# EAGLE schematic FRIDAY_Compute_SCH1 (EAGLE 9.6.2), part 2 of 2
## Sheet 5 of 5: S5: RK3576 Clock, Reset, Boot, PMIC Control & Debug UART
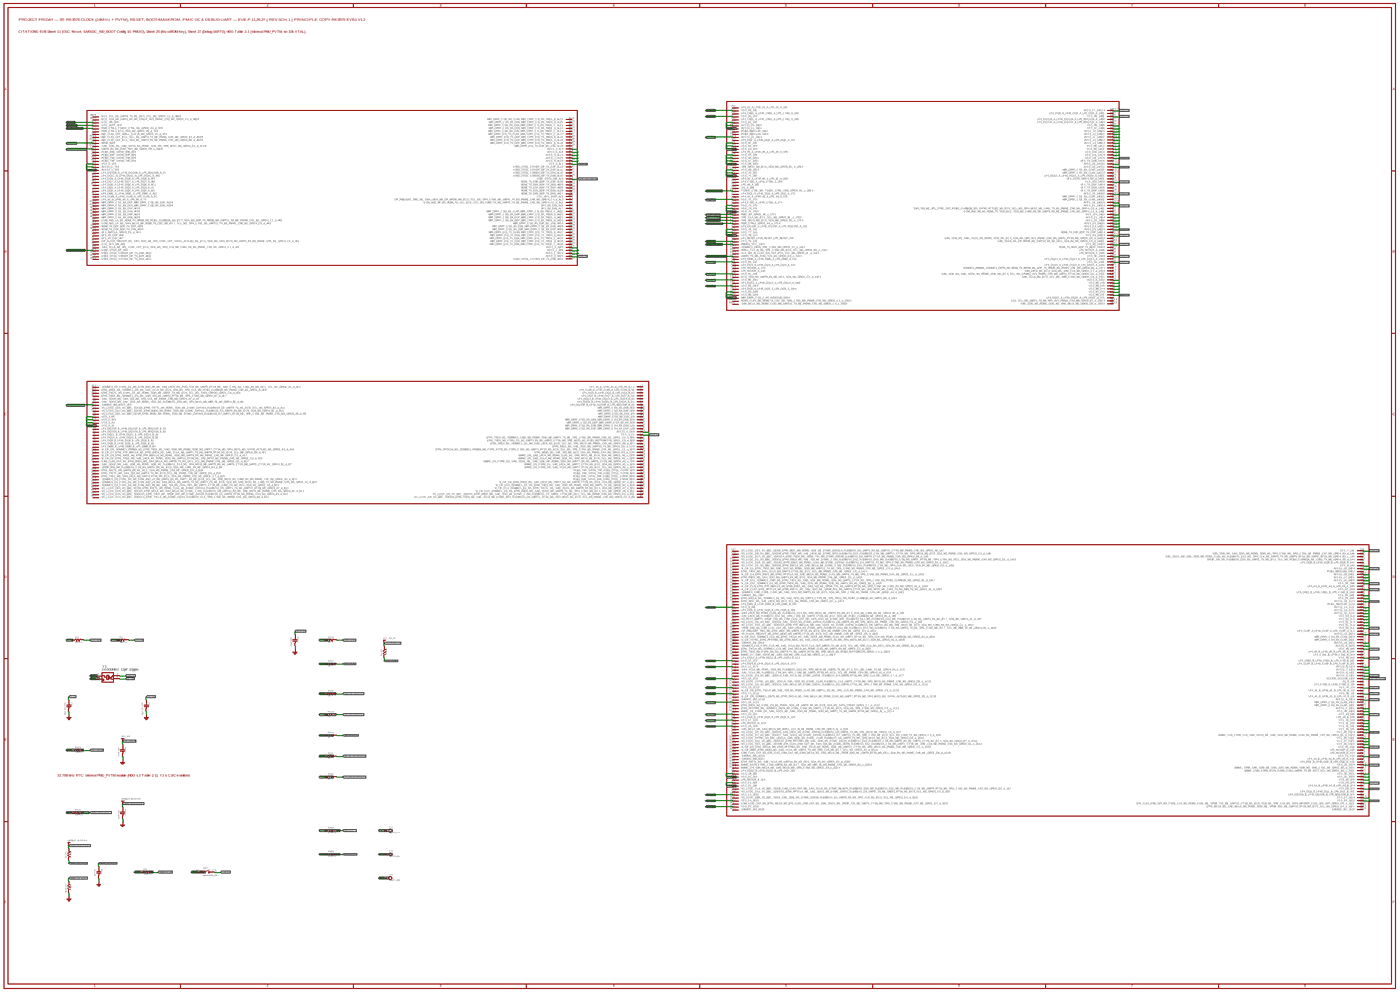
[diagram p13: schematic, sheet 5, overview]
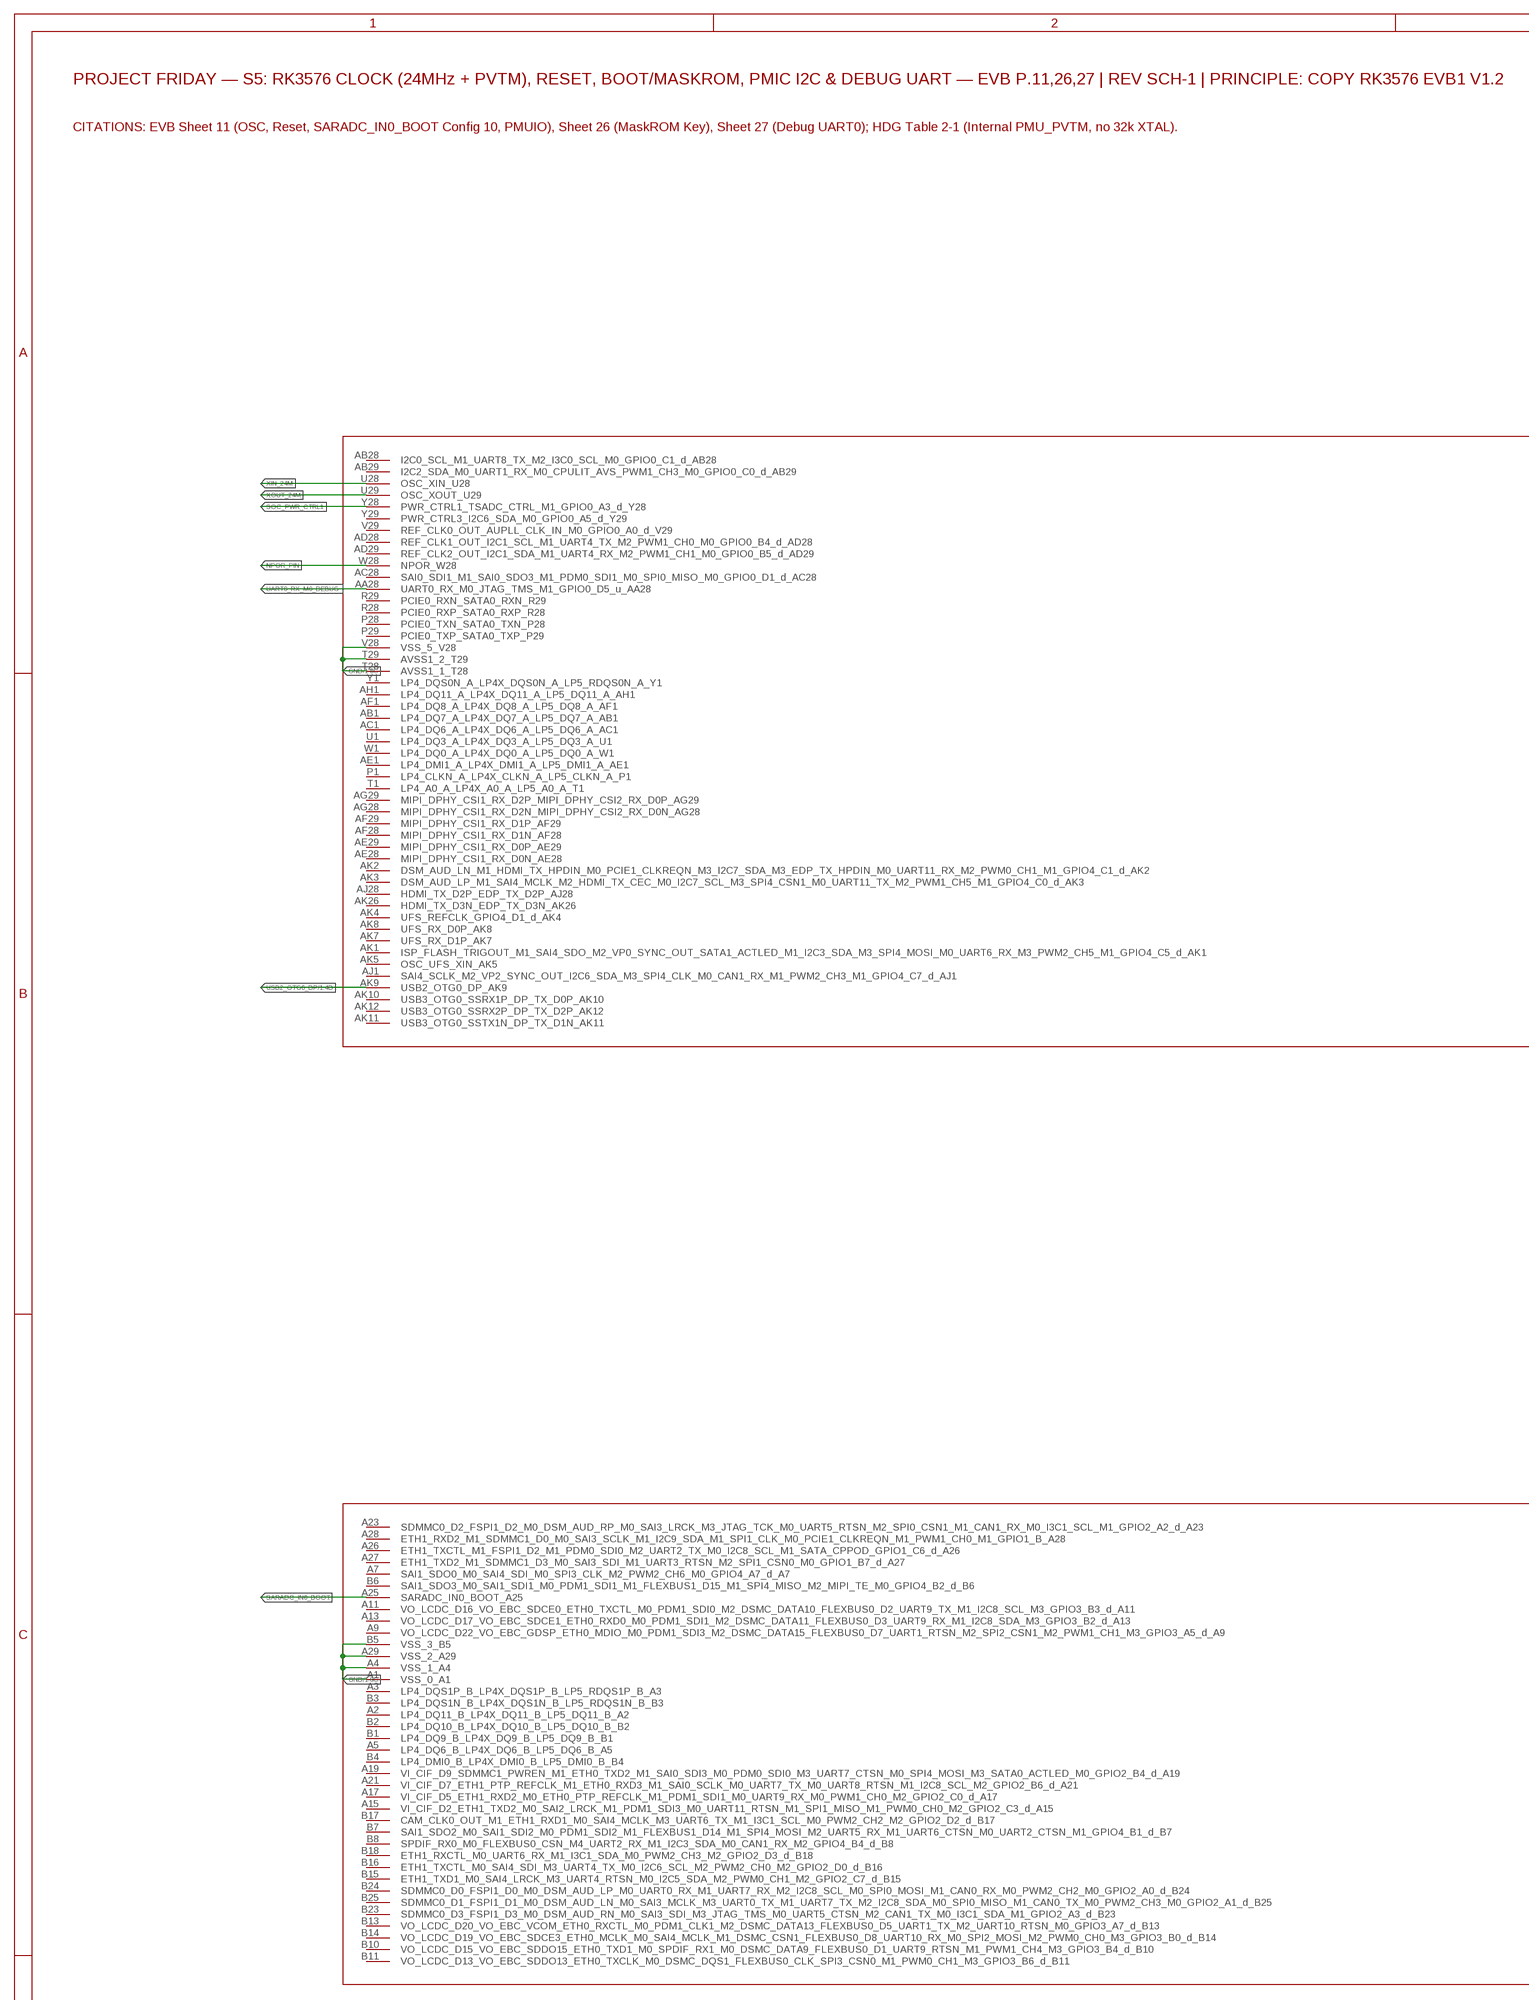
[diagram p14: schematic, sheet 5, part 1 of 8]
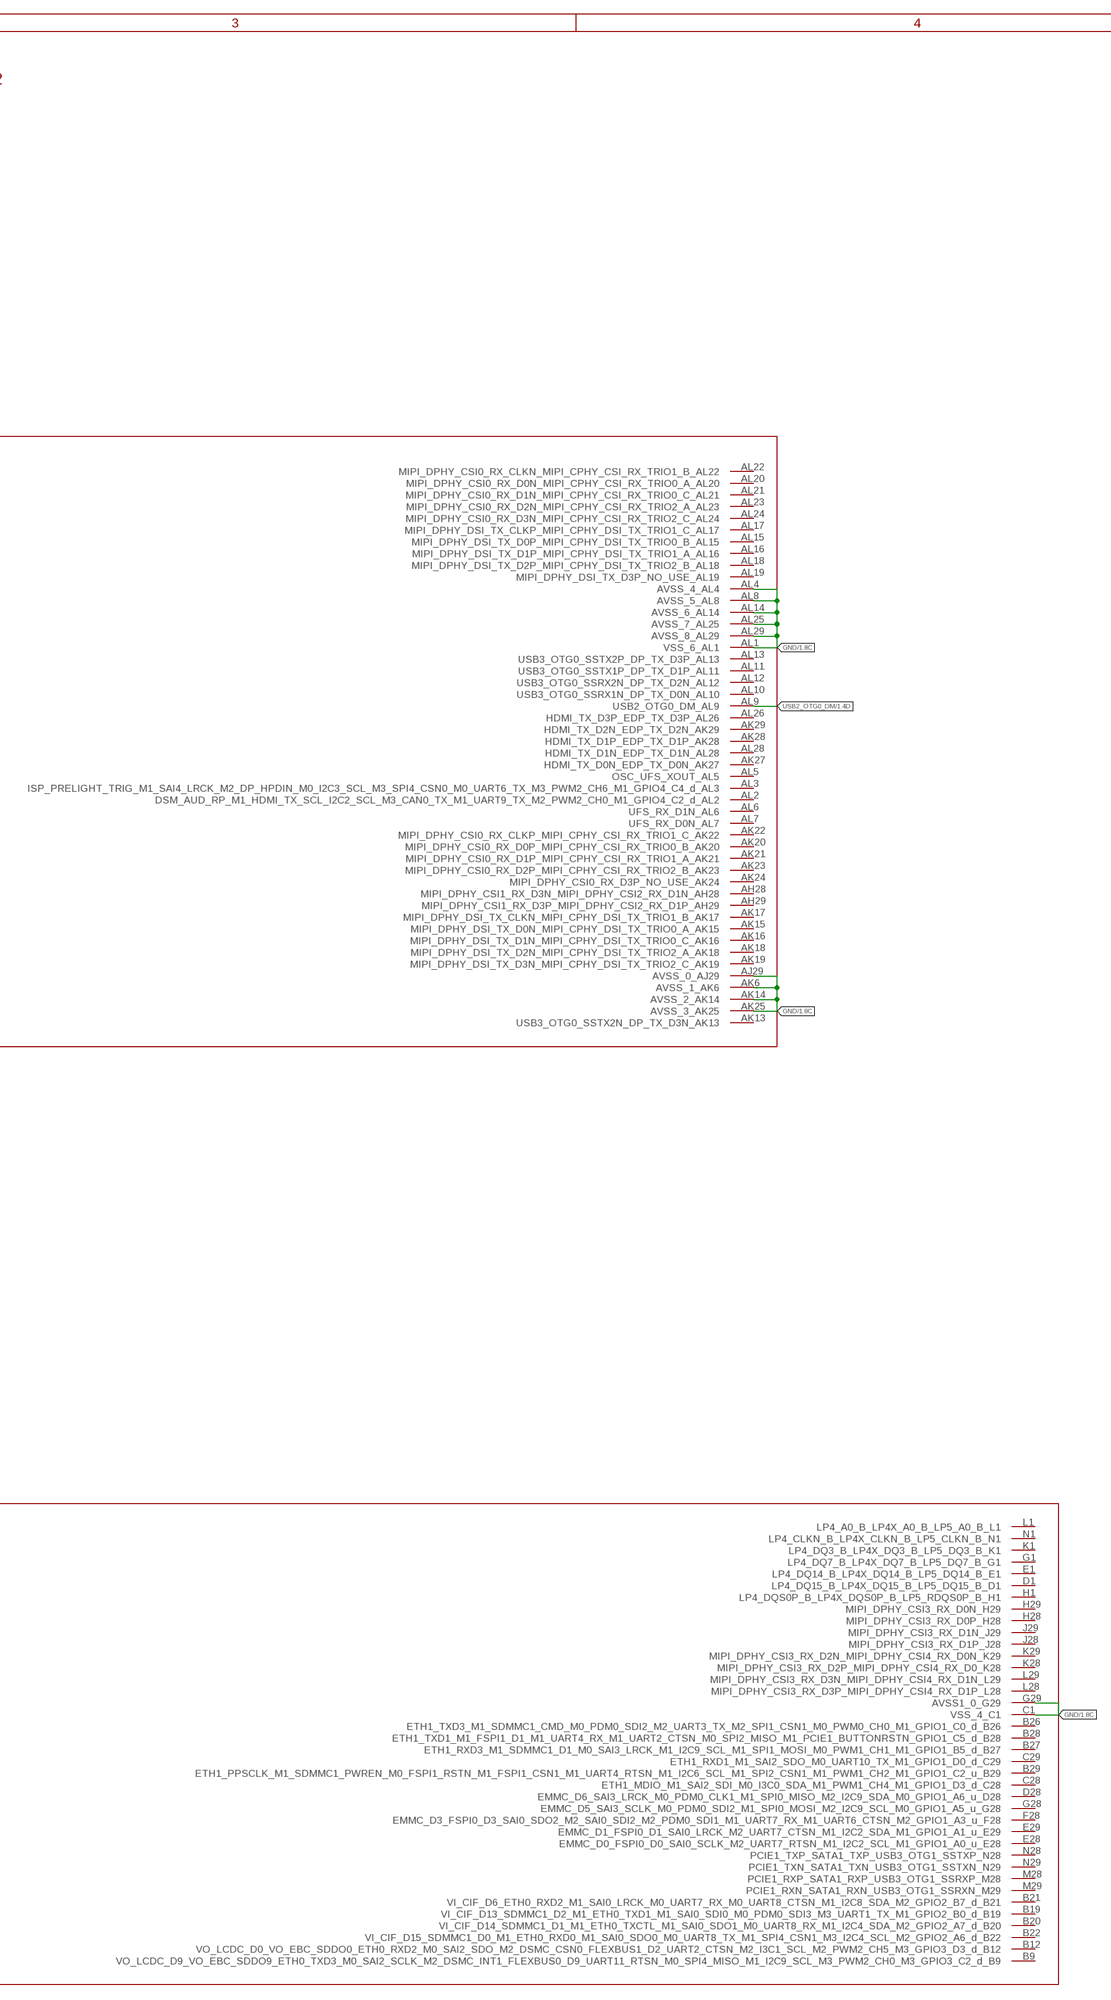
[diagram p15: schematic, sheet 5, part 2 of 8]
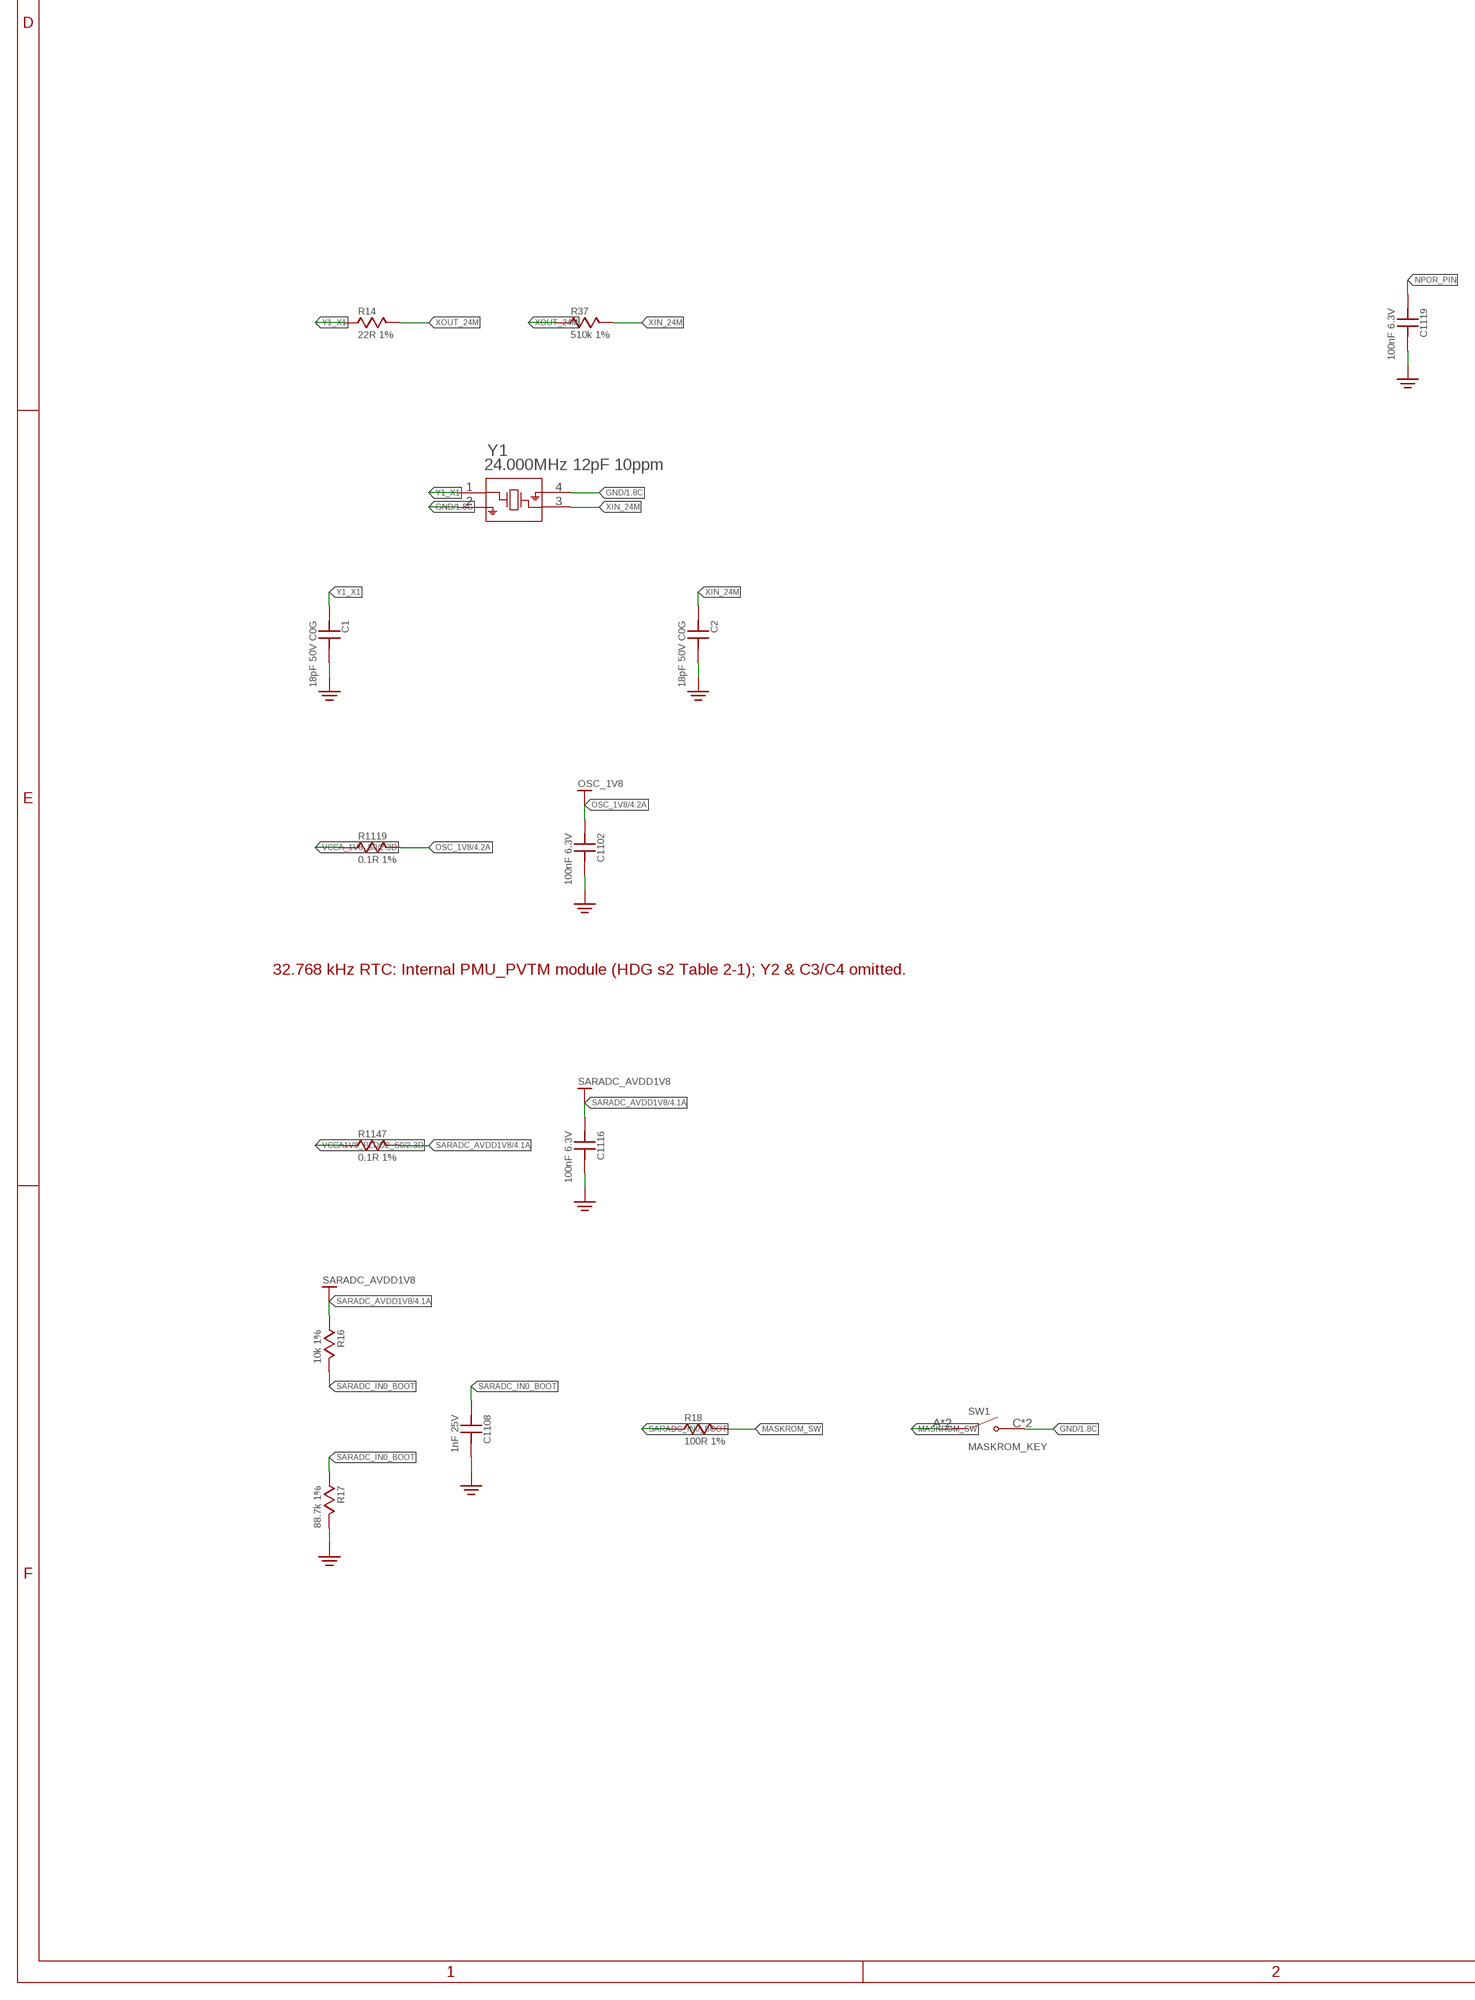
[diagram p16: schematic, sheet 5, part 3 of 8]
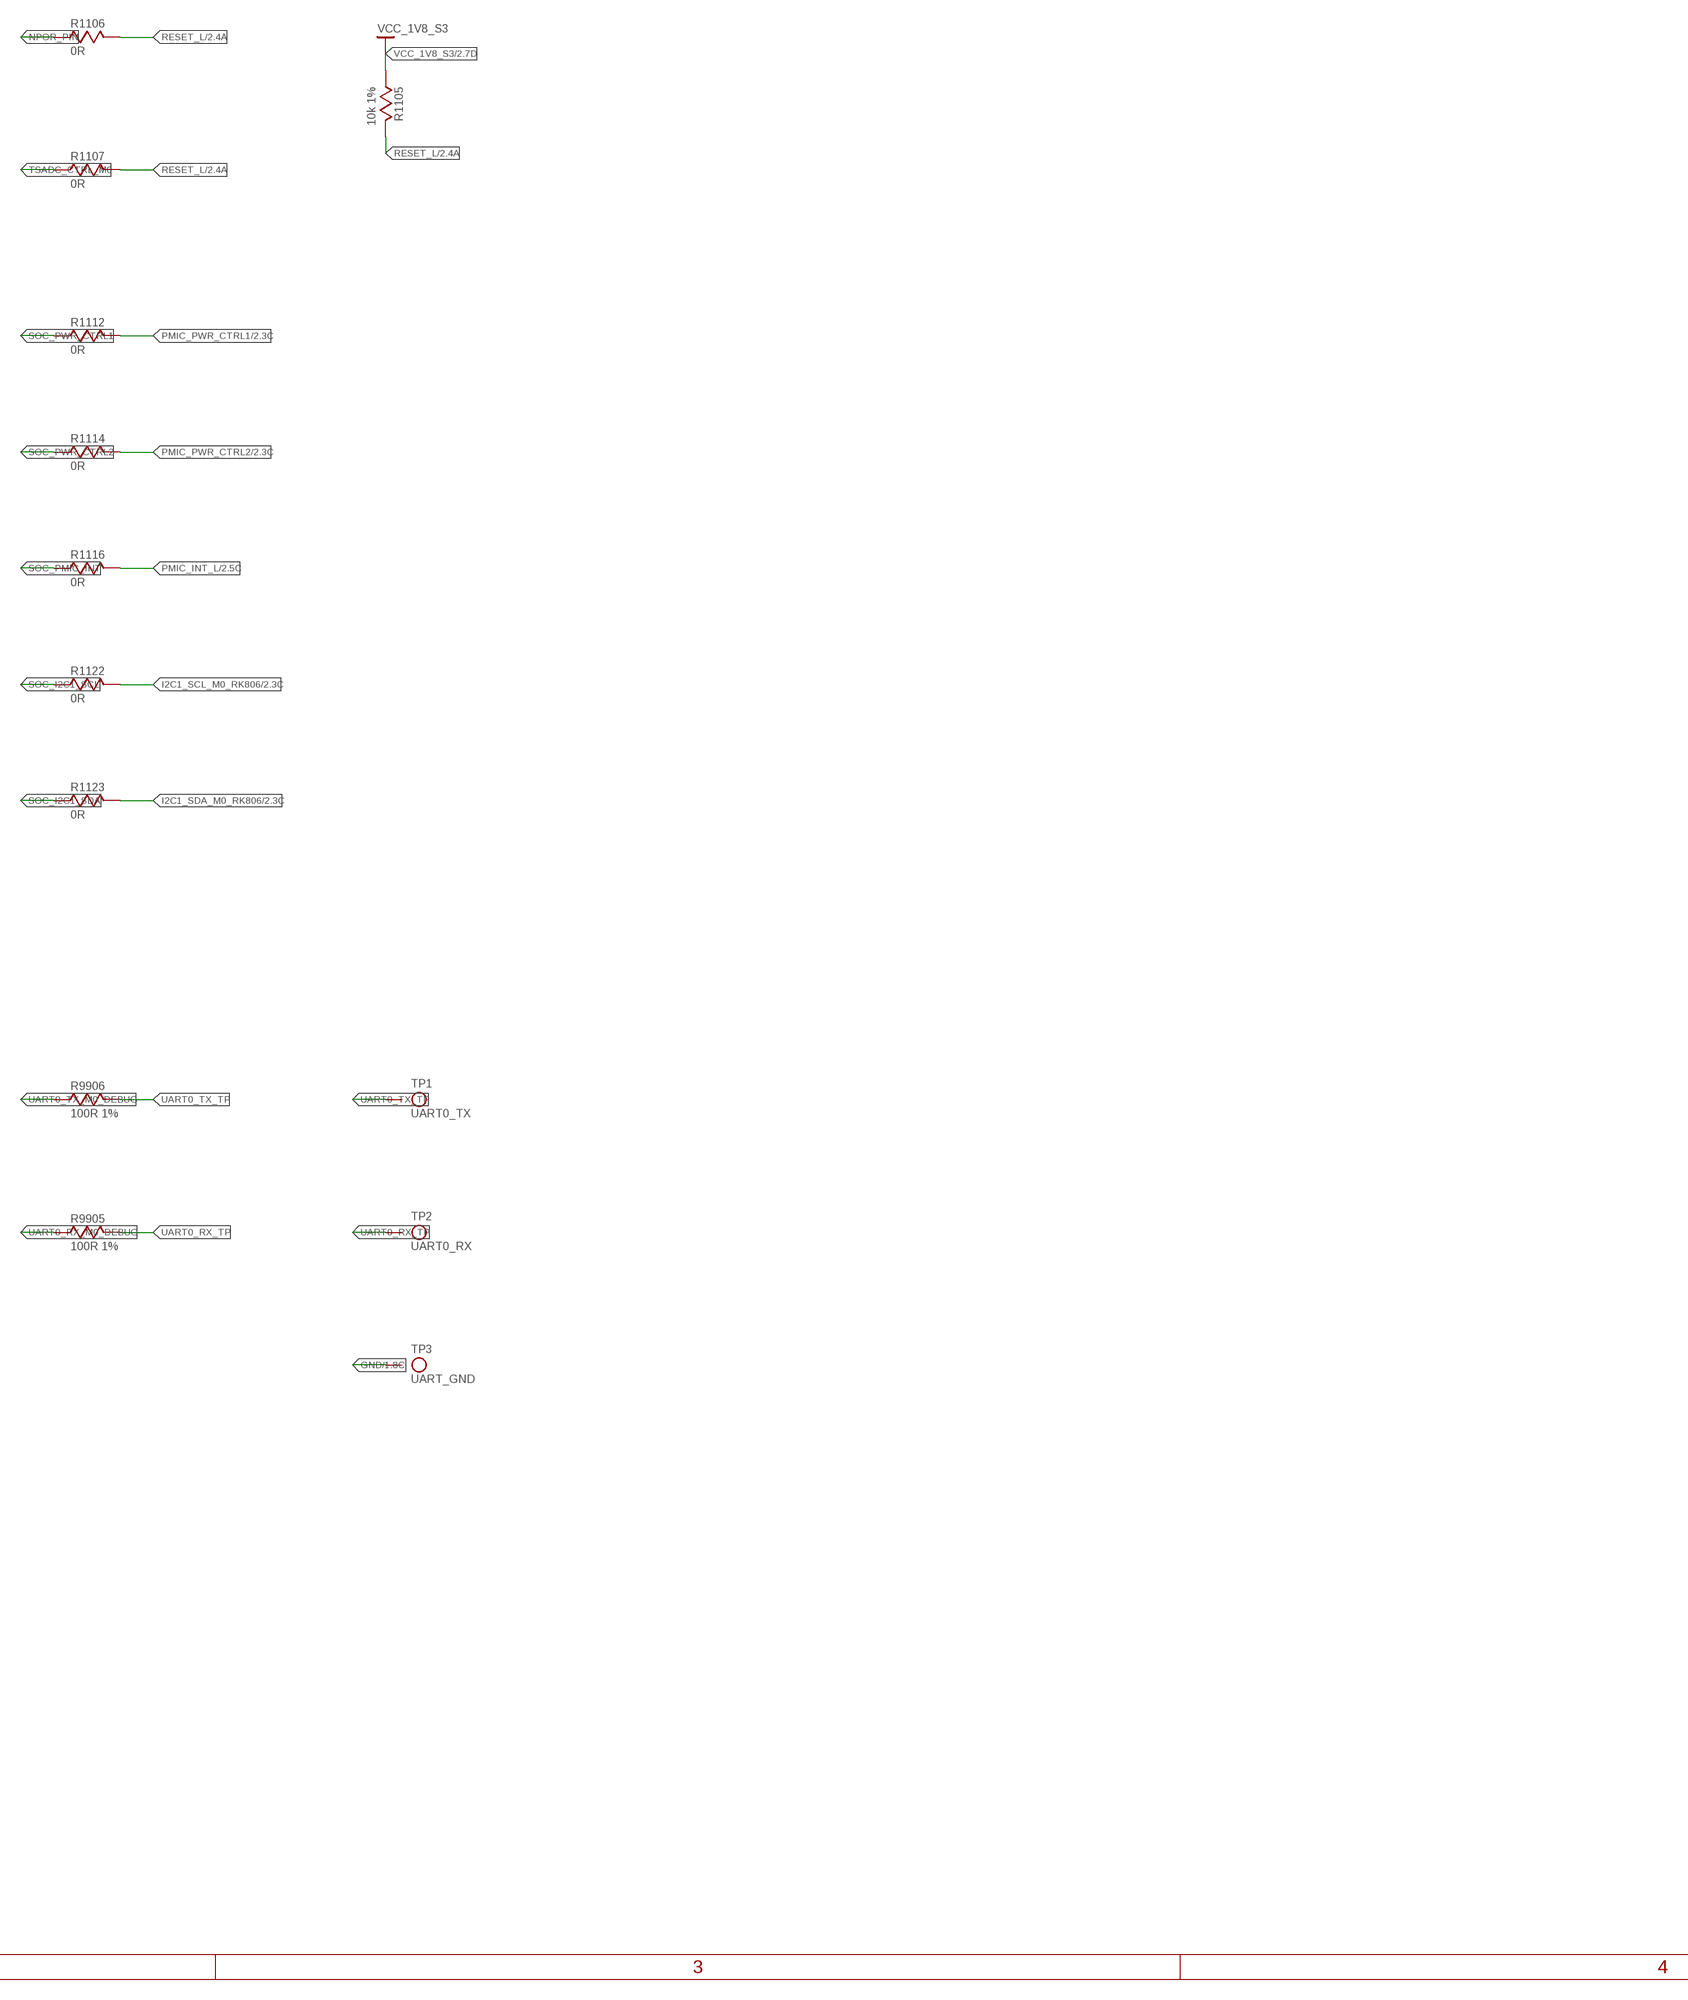
[diagram p17: schematic, sheet 5, part 4 of 8]
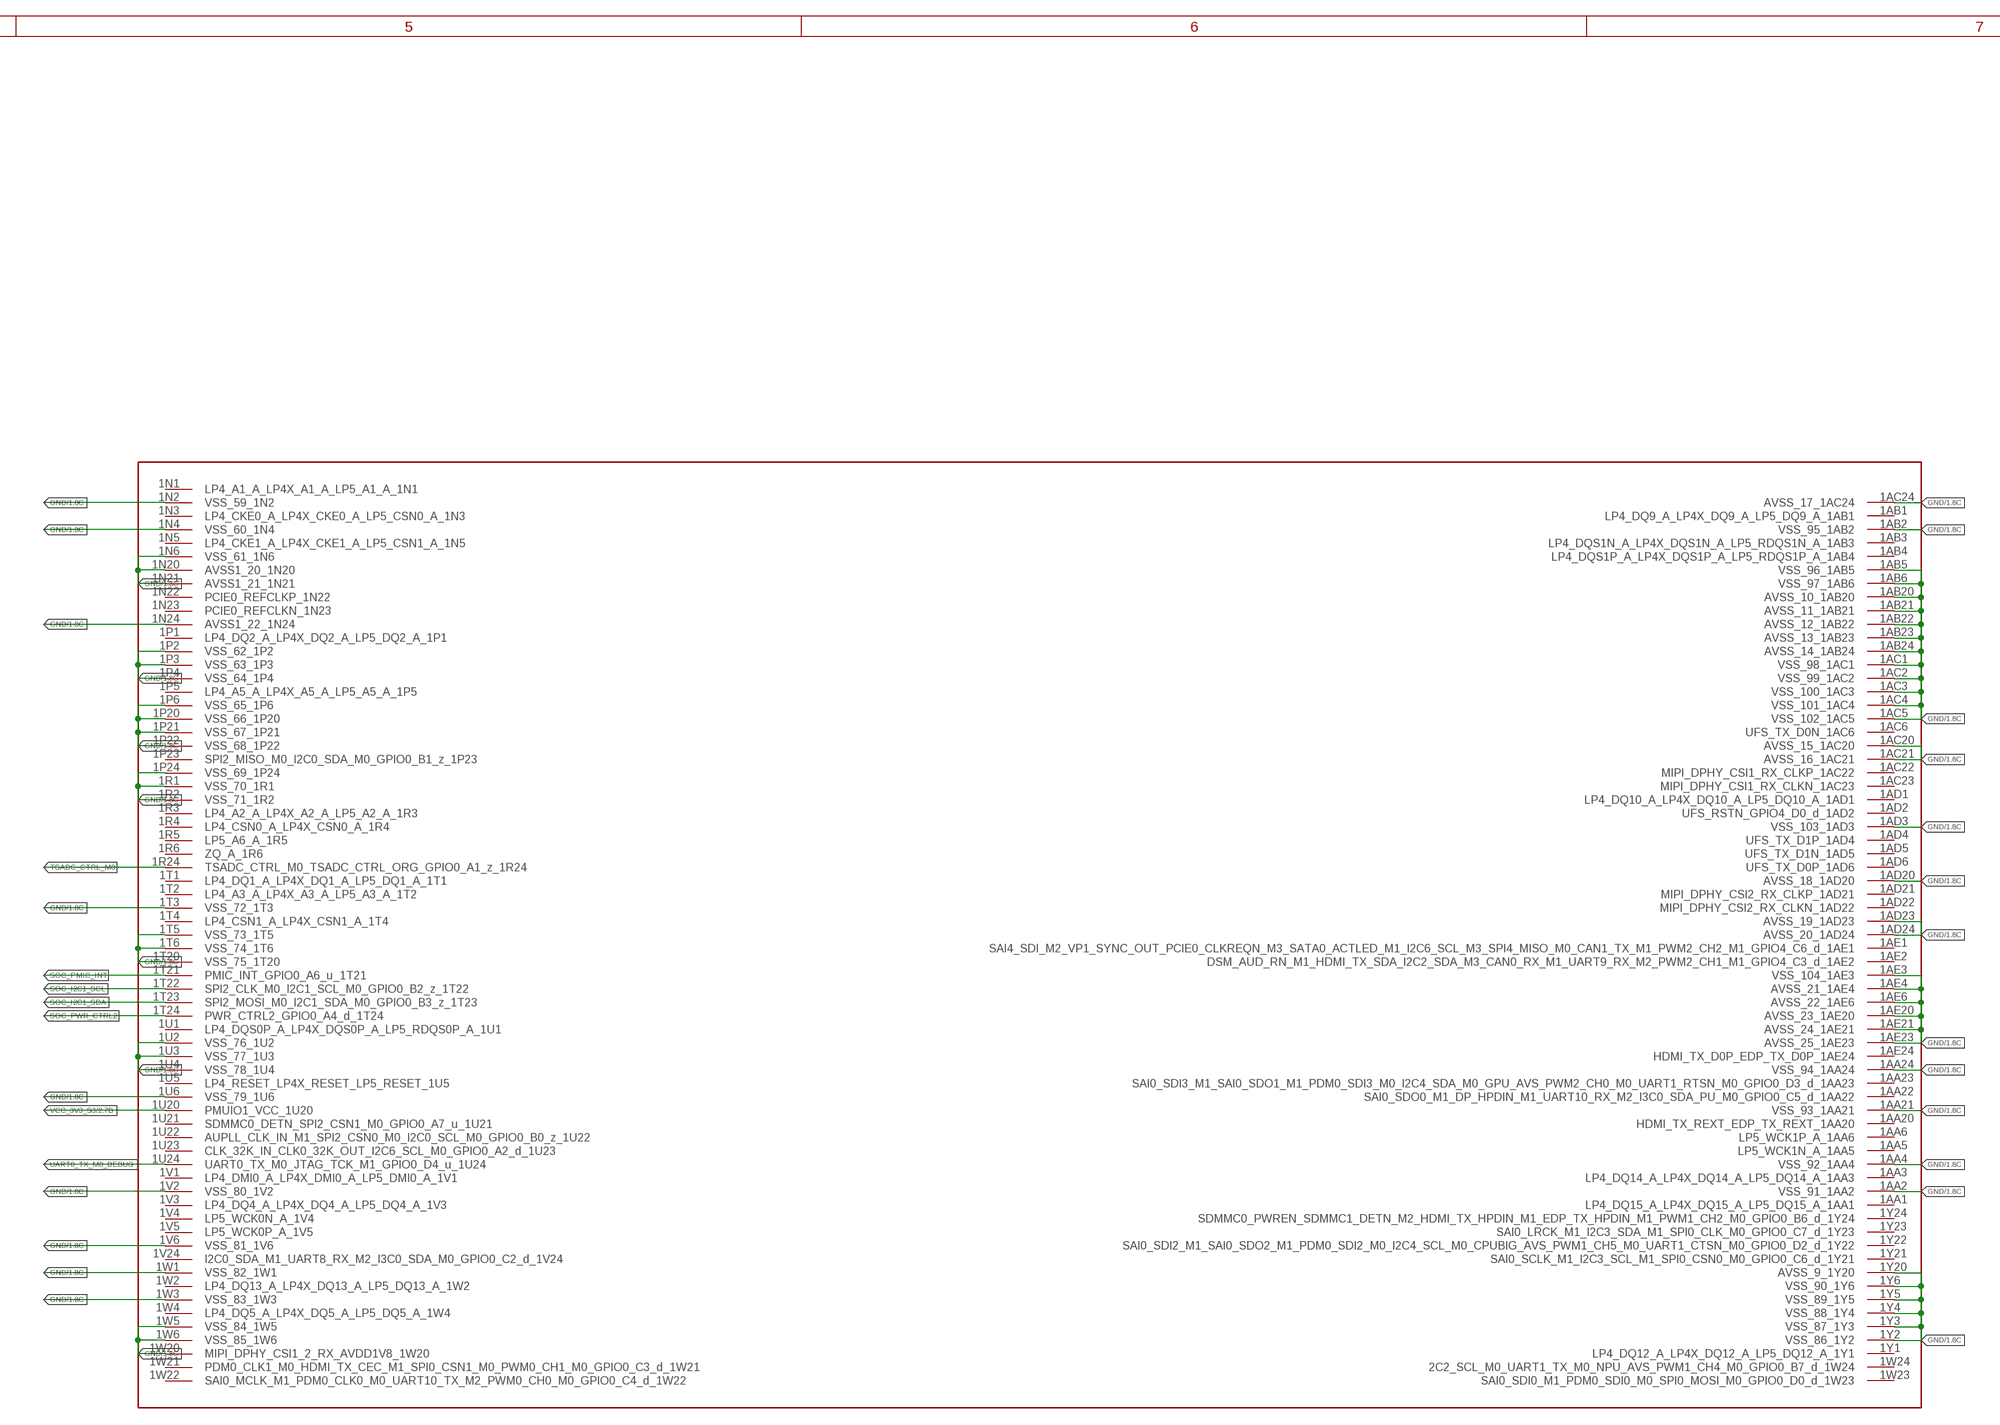
[diagram p18: schematic, sheet 5, part 5 of 8]
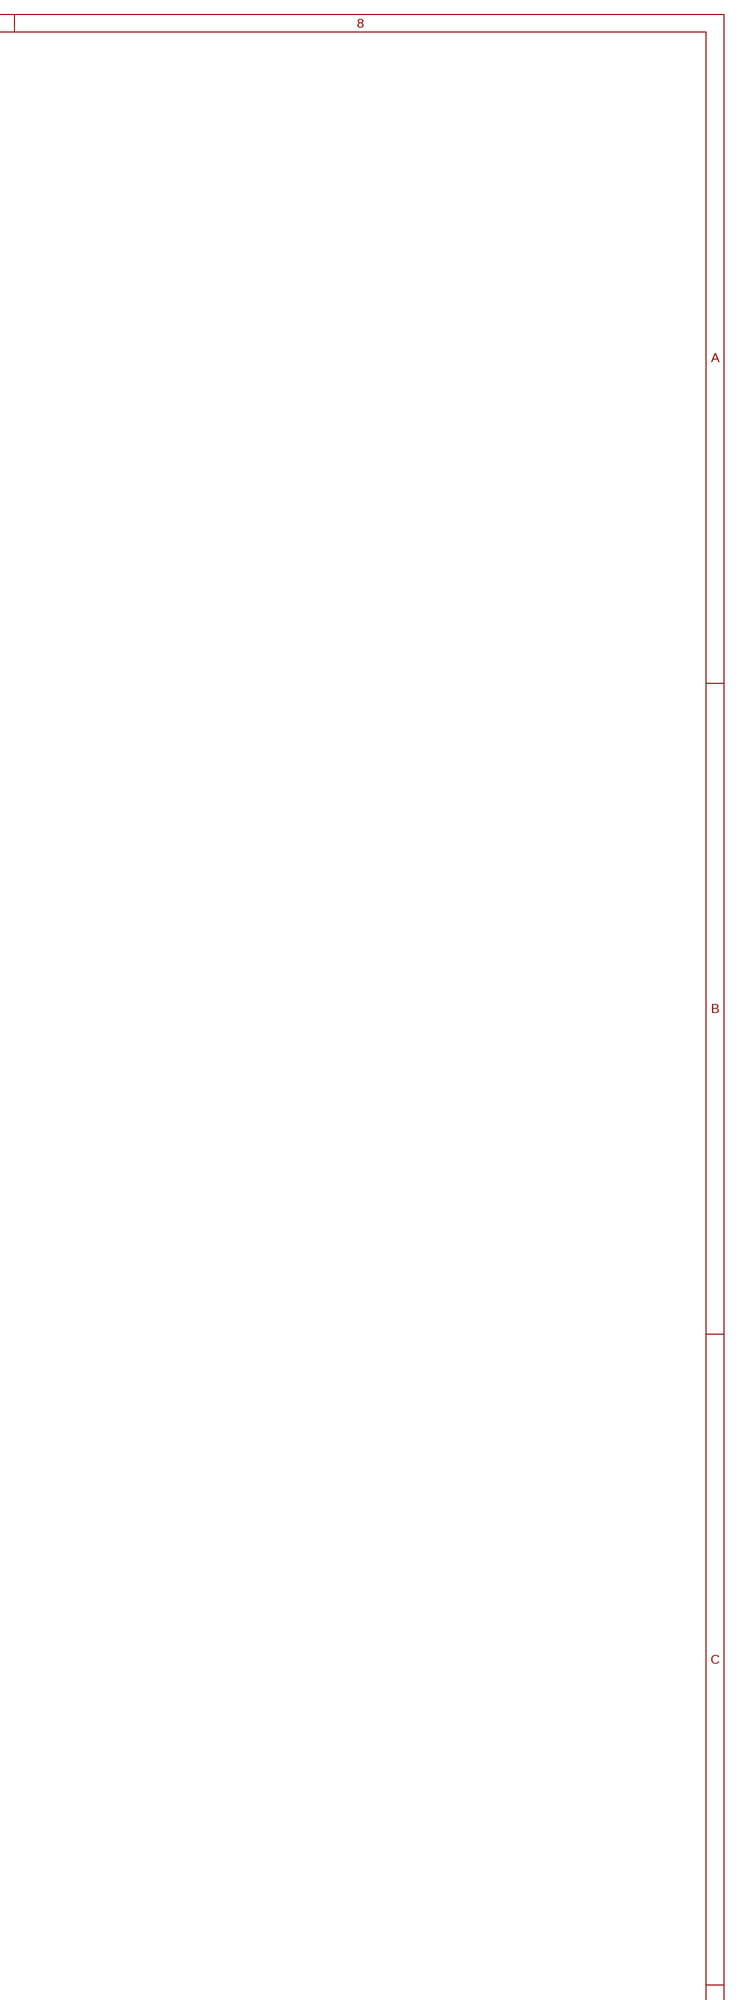
[diagram p19: schematic, sheet 5, part 6 of 8]
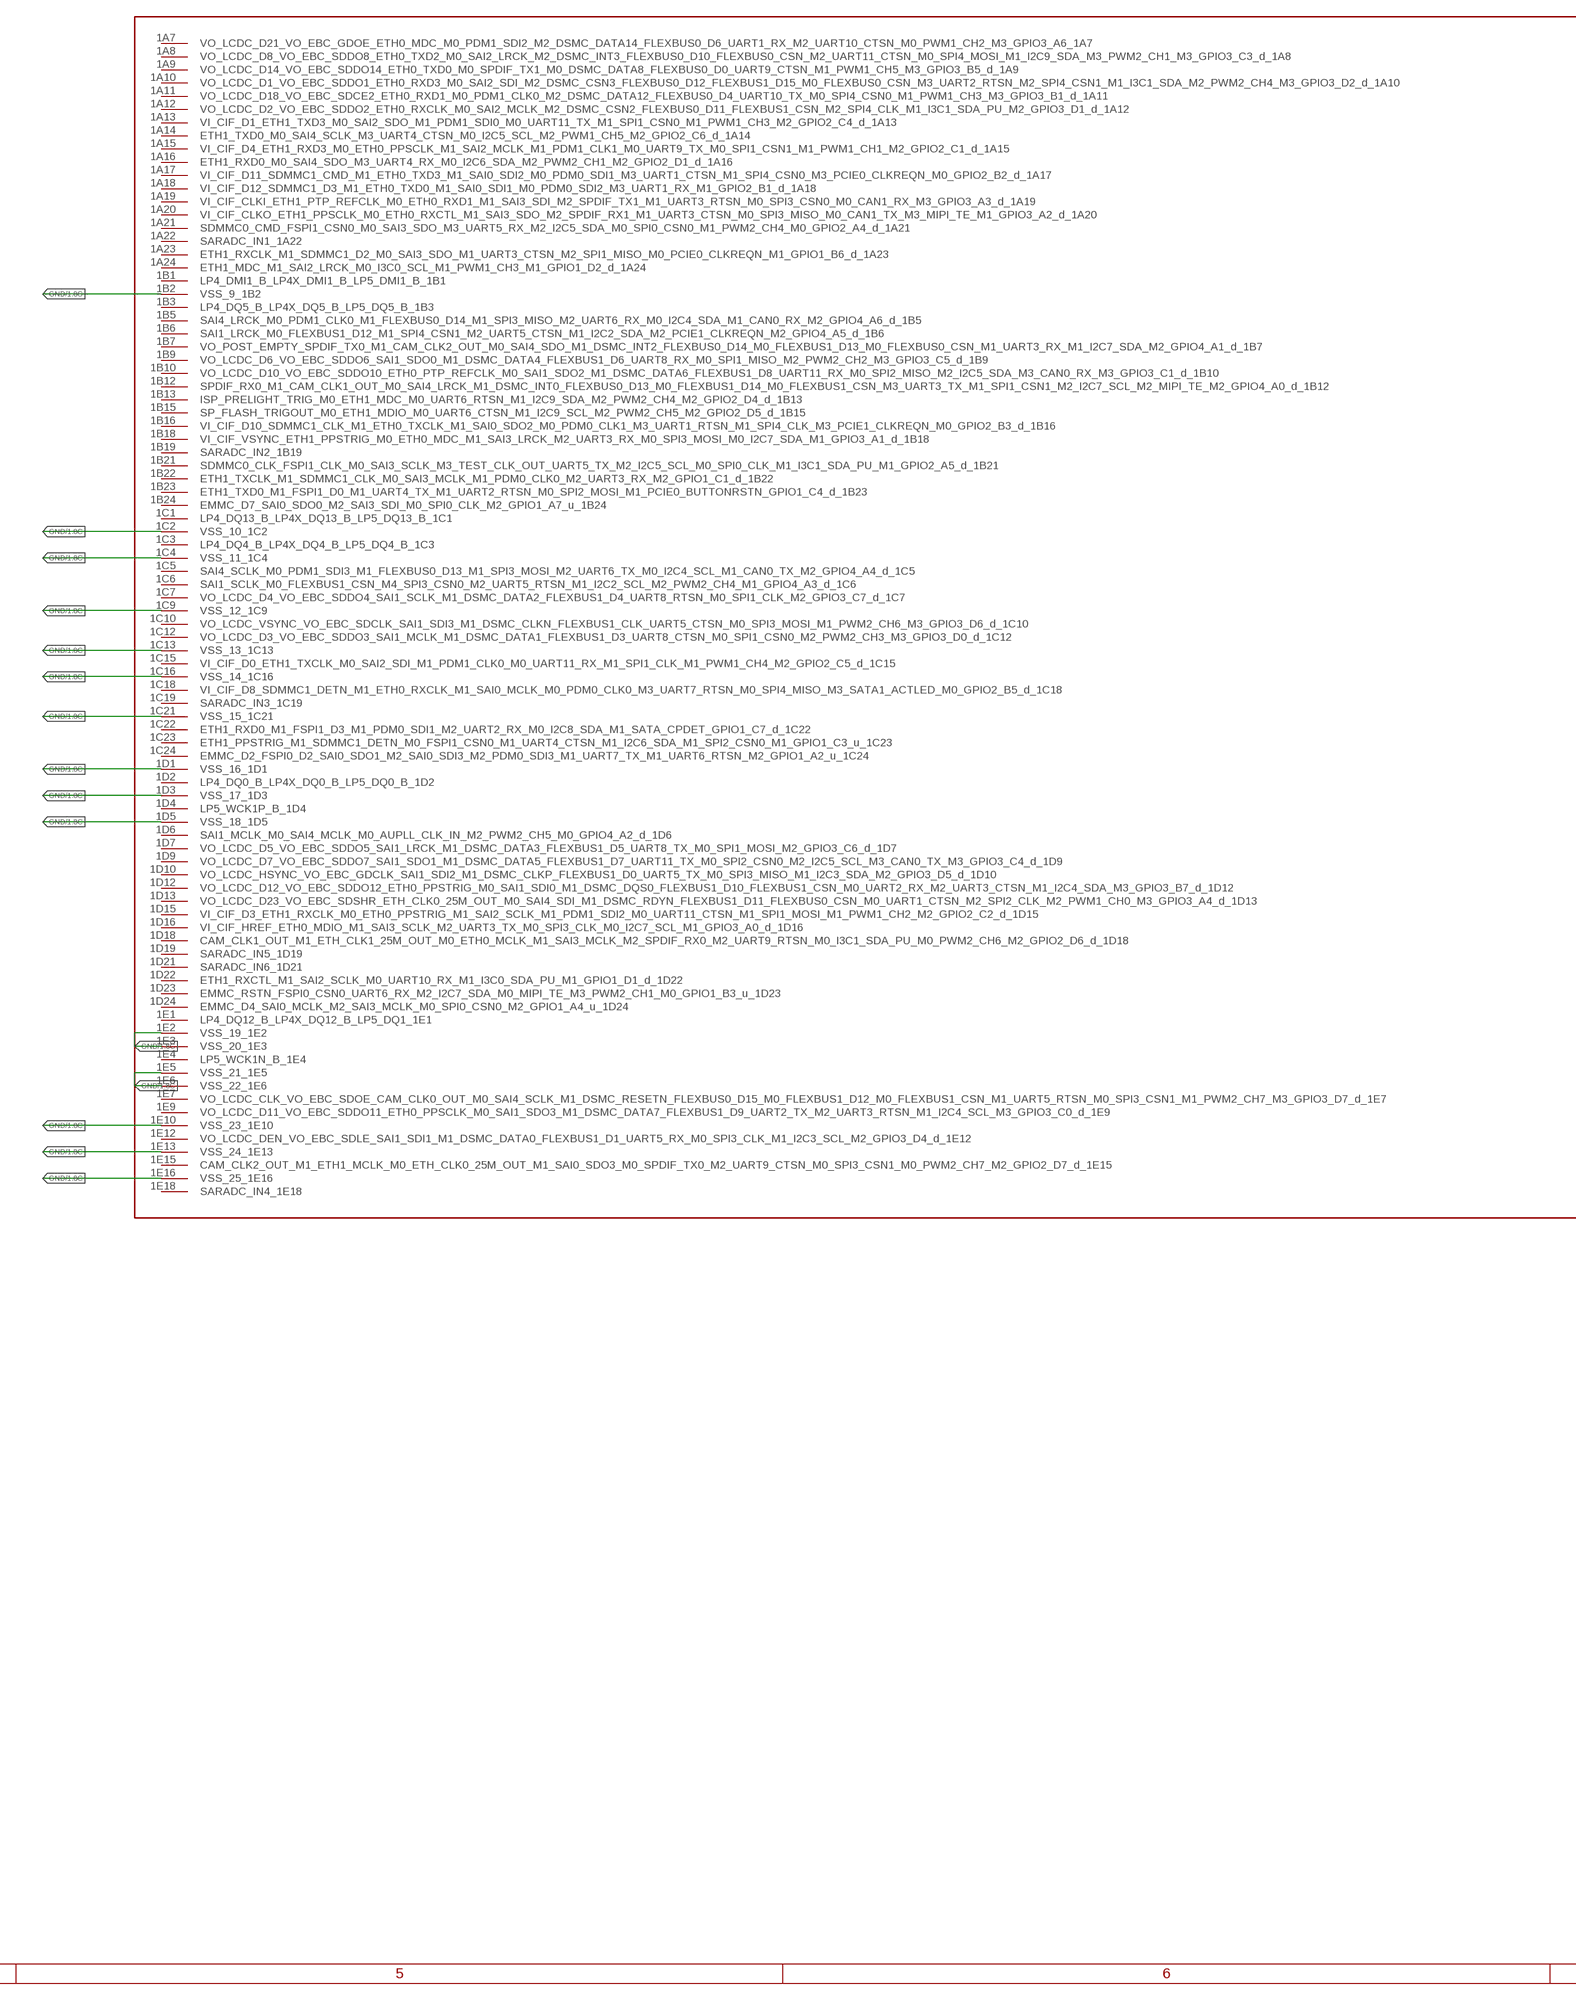
[diagram p20: schematic, sheet 5, part 7 of 8]
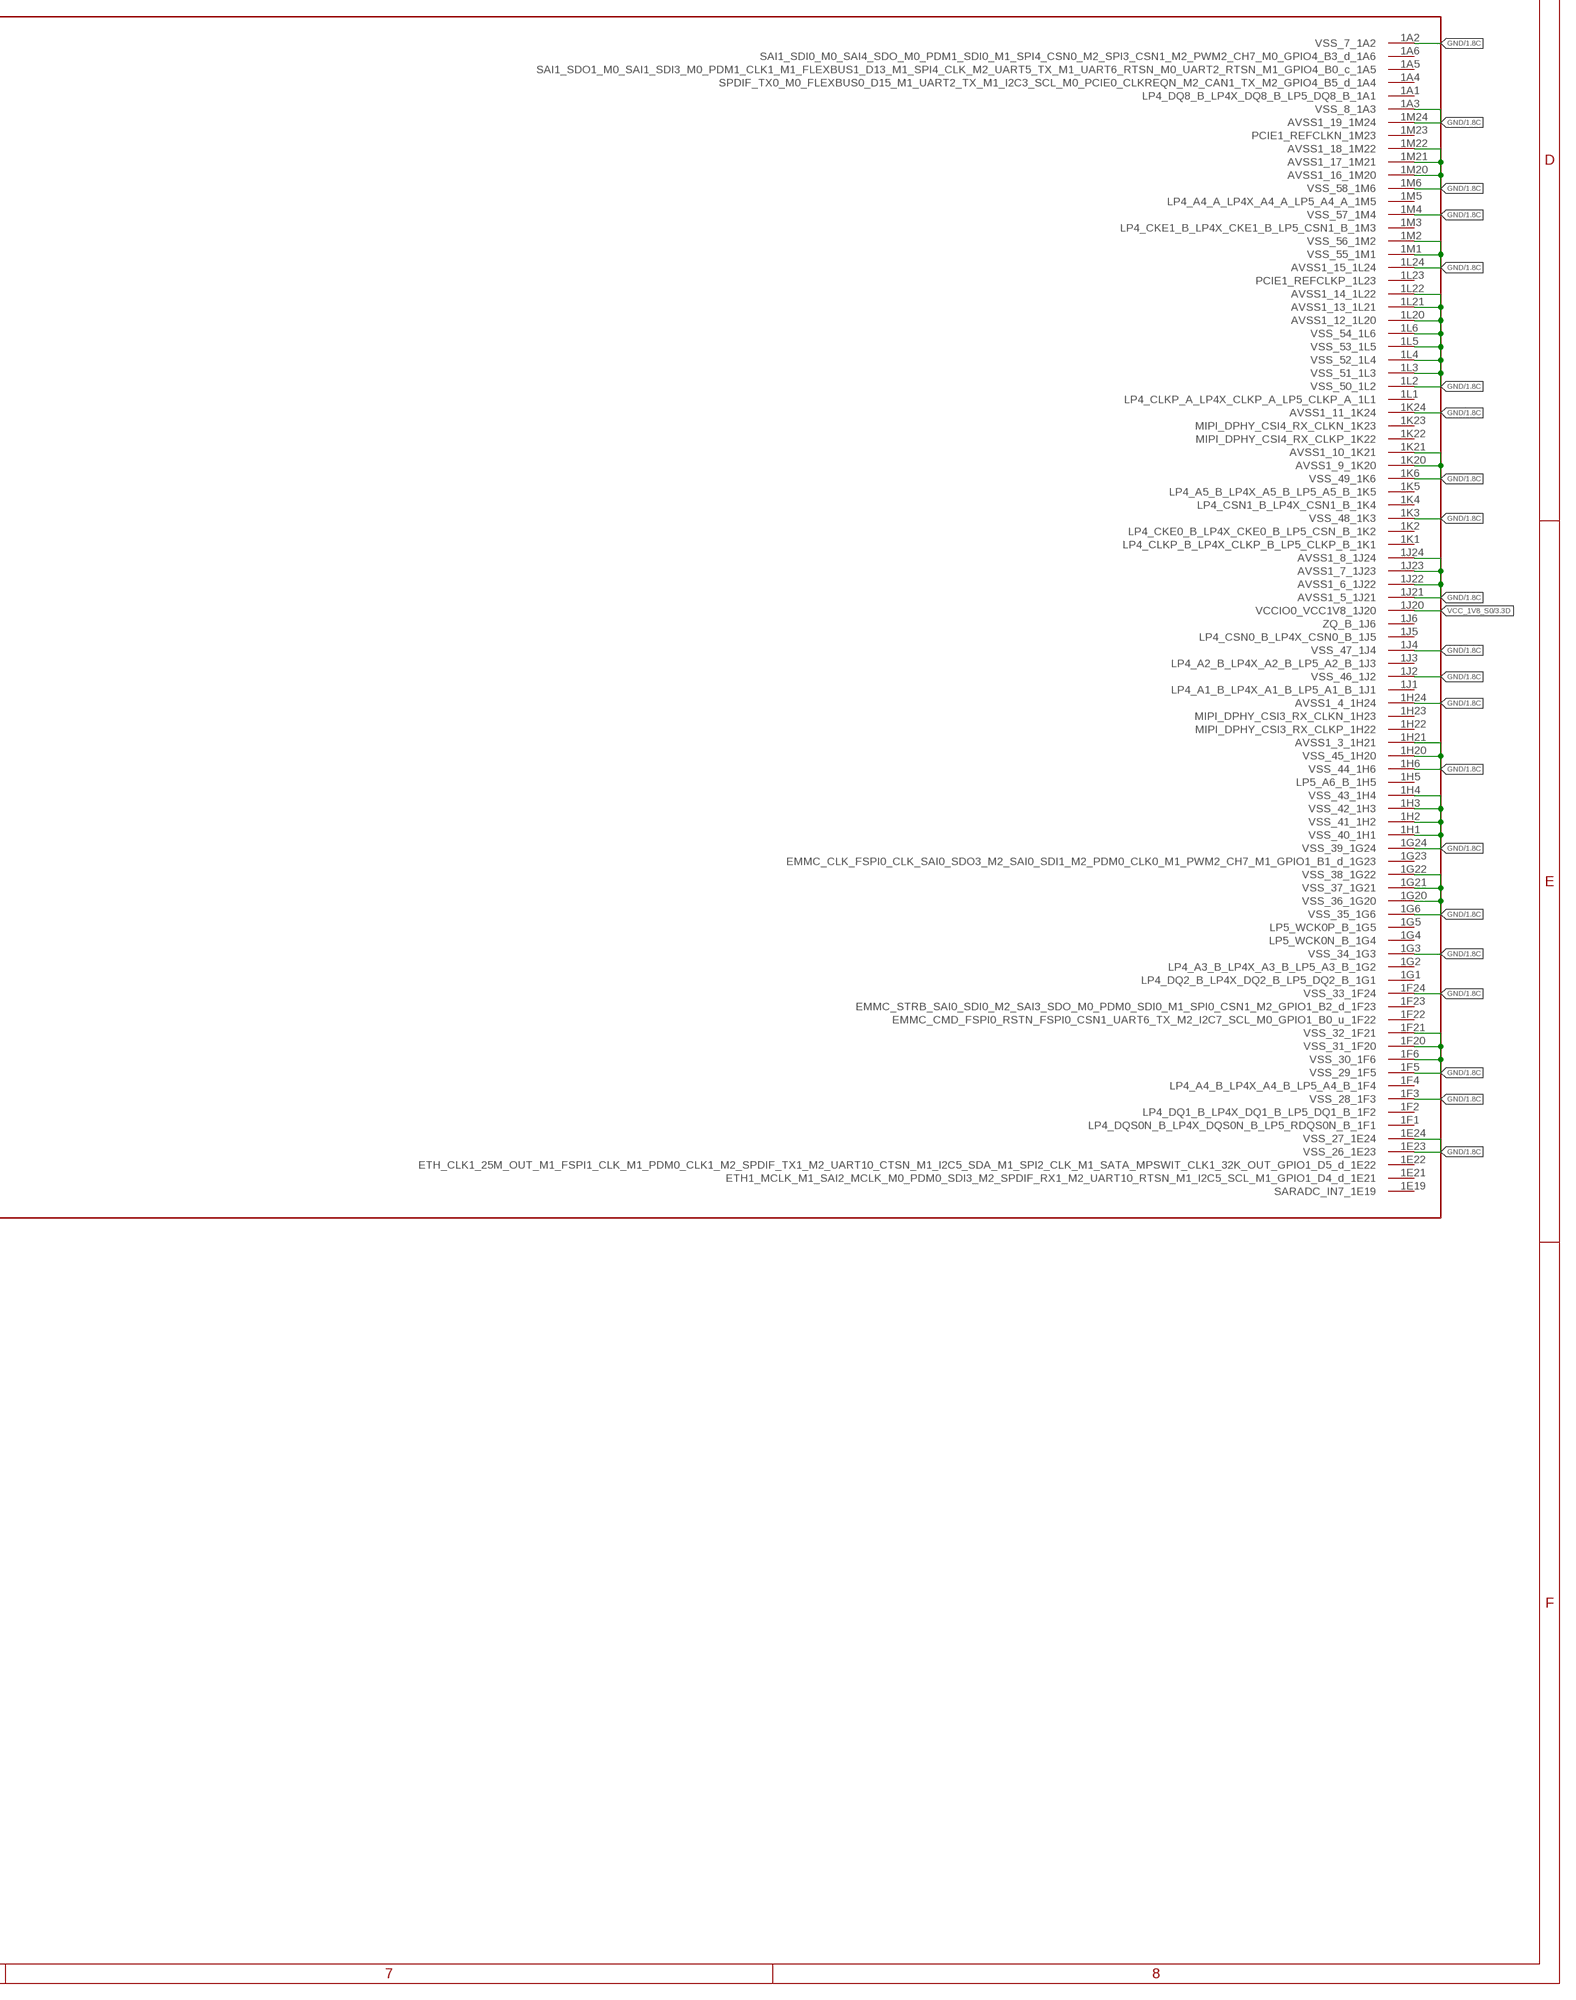
[diagram p21: schematic, sheet 5, part 8 of 8]

### Parts
C1  18pF 50V C0G  C_0402  [C0402]
C2  18pF 50V C0G  C_0402  [C0402]
C1102  100nF 6.3V  C_0201  [C0201]
C1108  1nF 25V  C_0201  [C0201]
C1116  100nF 6.3V  C_0201  [C0201]
C1119  100nF 6.3V  C_0201  [C0201]
PWR352  OSC_1V8  (no package)
PWR354  SARADC_AVDD1V8  (no package)
PWR356  SARADC_AVDD1V8  (no package)
PWR360  VCC_1V8_S3  (no package)
R14  22R 1%  R_0402  [R0402]
R16  10k 1%  R_0402  [R0402]
R17  88.7k 1%  R_0402  [R0402]
R18  100R 1%  R_0402  [R0402]
R37  510k 1%  R_0402  [R0402]
R1105  10k 1%  R_0402  [R0402]
R1106  0R  R_0201  [R0201]
R1107  0R  R_0201  [R0201]
R1112  0R  R_0201  [R0201]
R1114  0R  R_0201  [R0201]
R1116  0R  R_0201  [R0201]
R1119  0.1R 1%  R_0603  [R0603]
R1122  0R  R_0201  [R0201]
R1123  0R  R_0201  [R0201]
R1147  0.1R 1%  R_0603  [R0603]
R9905  100R 1%  R_0201  [R0201]
R9906  100R 1%  R_0201  [R0201]
SW1  MASKROM_KEY  TS-1187A-B-A-B  [SW_TS-1187A-B-A-B]
TP1  UART0_TX  TP_1MM  [TP_1MM]
TP2  UART0_RX  TP_1MM  [TP_1MM]
TP3  UART_GND  TP_1MM  [TP_1MM]
Y1  24.000MHz 12pF 10ppm  X322524MSB4SIX322524MSB4SI_YXC  [X322524MSB4SI_YXC]

### Nets
GND: C1.2 C2.2 C1102.2 C1108.2 C1116.2 C1119.2 R17.2 SW1.C(NO) SW1.D(NO) TP3.1 U1.1A2(U$3:VSS_7_1A2) U1.1A3(U$3:VSS_8_1A3) U1.1AA2(U$4:VSS_91_1AA2) U1.1AA4(U$4:VSS_92_1AA4) U1.1AA21(U$4:VSS_93_1AA21) U1.1AA24(U$4:VSS_94_1AA24) U1.1AB2(U$4:VSS_95_1AB2) U1.1AB5(U$4:VSS_96_1AB5) U1.1AB6(U$4:VSS_97_1AB6) U1.1AB20(U$4:AVSS_10_1AB20) U1.1AB21(U$4:AVSS_11_1AB21) U1.1AB22(U$4:AVSS_12_1AB22) U1.1AB23(U$4:AVSS_13_1AB23) U1.1AB24(U$4:AVSS_14_1AB24) U1.1AC1(U$4:VSS_98_1AC1) U1.1AC2(U$4:VSS_99_1AC2) U1.1AC3(U$4:VSS_100_1AC3) U1.1AC4(U$4:VSS_101_1AC4) U1.1AC5(U$4:VSS_102_1AC5) U1.1AC20(U$4:AVSS_15_1AC20) U1.1AC21(U$4:AVSS_16_1AC21) U1.1AC24(U$4:AVSS_17_1AC24) U1.1AD3(U$4:VSS_103_1AD3) U1.1AD20(U$4:AVSS_18_1AD20) U1.1AD23(U$4:AVSS_19_1AD23) U1.1AD24(U$4:AVSS_20_1AD24) U1.1AE3(U$4:VSS_104_1AE3) U1.1AE4(U$4:AVSS_21_1AE4) U1.1AE6(U$4:AVSS_22_1AE6) U1.1AE20(U$4:AVSS_23_1AE20) U1.1AE21(U$4:AVSS_24_1AE21) U1.1AE23(U$4:AVSS_25_1AE23) U1.1B2(U$3:VSS_9_1B2) U1.1C2(U$3:VSS_10_1C2) U1.1C4(U$3:VSS_11_1C4) U1.1C9(U$3:VSS_12_1C9) U1.1C13(U$3:VSS_13_1C13) U1.1C16(U$3:VSS_14_1C16) U1.1C21(U$3:VSS_15_1C21) U1.1D1(U$3:VSS_16_1D1) U1.1D3(U$3:VSS_17_1D3) U1.1D5(U$3:VSS_18_1D5) U1.1E2(U$3:VSS_19_1E2) U1.1E3(U$3:VSS_20_1E3) U1.1E5(U$3:VSS_21_1E5) U1.1E6(U$3:VSS_22_1E6) U1.1E10(U$3:VSS_23_1E10) U1.1E13(U$3:VSS_24_1E13) U1.1E16(U$3:VSS_25_1E16) U1.1E23(U$3:VSS_26_1E23) U1.1E24(U$3:VSS_27_1E24) U1.1F3(U$3:VSS_28_1F3) U1.1F5(U$3:VSS_29_1F5) U1.1F6(U$3:VSS_30_1F6) U1.1F20(U$3:VSS_31_1F20) U1.1F21(U$3:VSS_32_1F21) U1.1F24(U$3:VSS_33_1F24) U1.1G3(U$3:VSS_34_1G3) U1.1G6(U$3:VSS_35_1G6) U1.1G20(U$3:VSS_36_1G20) U1.1G21(U$3:VSS_37_1G21) U1.1G22(U$3:VSS_38_1G22) U1.1G24(U$3:VSS_39_1G24) U1.1H1(U$3:VSS_40_1H1) U1.1H2(U$3:VSS_41_1H2) U1.1H3(U$3:VSS_42_1H3) U1.1H4(U$3:VSS_43_1H4) U1.1H6(U$3:VSS_44_1H6) U1.1H20(U$3:VSS_45_1H20) U1.1H21(U$3:AVSS1_3_1H21) U1.1H24(U$3:AVSS1_4_1H24) U1.1J2(U$3:VSS_46_1J2) U1.1J4(U$3:VSS_47_1J4) U1.1J21(U$3:AVSS1_5_1J21) U1.1J22(U$3:AVSS1_6_1J22) U1.1J23(U$3:AVSS1_7_1J23) U1.1J24(U$3:AVSS1_8_1J24) U1.1K3(U$3:VSS_48_1K3) U1.1K6(U$3:VSS_49_1K6) U1.1K20(U$3:AVSS1_9_1K20) U1.1K21(U$3:AVSS1_10_1K21) U1.1K24(U$3:AVSS1_11_1K24) U1.1L2(U$3:VSS_50_1L2) U1.1L3(U$3:VSS_51_1L3) U1.1L4(U$3:VSS_52_1L4) U1.1L5(U$3:VSS_53_1L5) U1.1L6(U$3:VSS_54_1L6) U1.1L20(U$3:AVSS1_12_1L20) U1.1L21(U$3:AVSS1_13_1L21) U1.1L22(U$3:AVSS1_14_1L22) U1.1L24(U$3:AVSS1_15_1L24) U1.1M1(U$3:VSS_55_1M1) U1.1M2(U$3:VSS_56_1M2) U1.1M4(U$3:VSS_57_1M4) U1.1M6(U$3:VSS_58_1M6) U1.1M20(U$3:AVSS1_16_1M20) U1.1M21(U$3:AVSS1_17_1M21) U1.1M22(U$3:AVSS1_18_1M22) U1.1M24(U$3:AVSS1_19_1M24) U1.1N2(U$4:VSS_59_1N2) U1.1N4(U$4:VSS_60_1N4) U1.1N6(U$4:VSS_61_1N6) U1.1N20(U$4:AVSS1_20_1N20) U1.1N21(U$4:AVSS1_21_1N21) U1.1N24(U$4:AVSS1_22_1N24) U1.1P2(U$4:VSS_62_1P2) U1.1P3(U$4:VSS_63_1P3) U1.1P4(U$4:VSS_64_1P4) U1.1P6(U$4:VSS_65_1P6) U1.1P20(U$4:VSS_66_1P20) U1.1P21(U$4:VSS_67_1P21) U1.1P22(U$4:VSS_68_1P22) U1.1P24(U$4:VSS_69_1P24) U1.1R1(U$4:VSS_70_1R1) U1.1R2(U$4:VSS_71_1R2) U1.1T3(U$4:VSS_72_1T3) U1.1T5(U$4:VSS_73_1T5) U1.1T6(U$4:VSS_74_1T6) U1.1T20(U$4:VSS_75_1T20) U1.1U2(U$4:VSS_76_1U2) U1.1U3(U$4:VSS_77_1U3) U1.1U4(U$4:VSS_78_1U4) U1.1U6(U$4:VSS_79_1U6) U1.1V2(U$4:VSS_80_1V2) U1.1V6(U$4:VSS_81_1V6) U1.1W1(U$4:VSS_82_1W1) U1.1W3(U$4:VSS_83_1W3) U1.1W5(U$4:VSS_84_1W5) U1.1W6(U$4:VSS_85_1W6) U1.1W20(U$4:MIPI_DPHY_CSI1_2_RX_AVDD1V8_1W20) U1.1Y2(U$4:VSS_86_1Y2) U1.1Y3(U$4:VSS_87_1Y3) U1.1Y4(U$4:VSS_88_1Y4) U1.1Y5(U$4:VSS_89_1Y5) U1.1Y6(U$4:VSS_90_1Y6) U1.1Y20(U$4:AVSS_9_1Y20) U1.A1(U$1:VSS_0_A1) U1.A4(U$1:VSS_1_A4) U1.A29(U$1:VSS_2_A29) U1.AJ29(U$2:AVSS_0_AJ29) U1.AK6(U$2:AVSS_1_AK6) U1.AK14(U$2:AVSS_2_AK14) U1.AK25(U$2:AVSS_3_AK25) U1.AL1(U$2:VSS_6_AL1) U1.AL4(U$2:AVSS_4_AL4) U1.AL8(U$2:AVSS_5_AL8) U1.AL14(U$2:AVSS_6_AL14) U1.AL25(U$2:AVSS_7_AL25) U1.AL29(U$2:AVSS_8_AL29) U1.B5(U$1:VSS_3_B5) U1.C1(U$1:VSS_4_C1) U1.G29(U$1:AVSS1_0_G29) U1.T28(U$2:AVSS1_1_T28) U1.T29(U$2:AVSS1_2_T29) U1.V28(U$2:VSS_5_V28) Y1.2 Y1.4 ; also sheet 1,2,3,4
I2C1_SCL_M0_RK806: R1122.2 ; also sheet 2
I2C1_SDA_M0_RK806: R1123.2 ; also sheet 2
MASKROM_SW: R18.2 SW1.A(COM) SW1.B(COM)
NPOR_PIN: C1119.1 R1106.1 U1.W28(U$2:NPOR_W28)
OSC_1V8: C1102.1 PWR352.OSC_1V8 R1119.2 ; also sheet 4
PMIC_INT_L: R1116.2 ; also sheet 2
PMIC_PWR_CTRL1: R1112.2 ; also sheet 2
PMIC_PWR_CTRL2: R1114.2 ; also sheet 2
RESET_L: R1105.2 R1106.2 R1107.2 ; also sheet 2
SARADC_AVDD1V8: C1116.1 PWR354.SARADC_AVDD1V8 PWR356.SARADC_AVDD1V8 R16.1 R1147.2 ; also sheet 4
SARADC_IN0_BOOT: C1108.1 R16.2 R17.1 R18.1 U1.A25(U$1:SARADC_IN0_BOOT_A25)
SOC_I2C1_SCL: R1122.1 U1.1T22(U$4:SPI2_CLK_M0_I2C1_SCL_M0_GPIO0_B2_z_1T22)
SOC_I2C1_SDA: R1123.1 U1.1T23(U$4:SPI2_MOSI_M0_I2C1_SDA_M0_GPIO0_B3_z_1T23)
SOC_PMIC_INT: R1116.1 U1.1T21(U$4:PMIC_INT_GPIO0_A6_u_1T21)
SOC_PWR_CTRL1: R1112.1 U1.Y28(U$2:PWR_CTRL1_TSADC_CTRL_M1_GPIO0_A3_d_Y28)
SOC_PWR_CTRL2: R1114.1 U1.1T24(U$4:PWR_CTRL2_GPIO0_A4_d_1T24)
TSADC_CTRL_M0: R1107.1 U1.1R24(U$4:TSADC_CTRL_M0_TSADC_CTRL_ORG_GPIO0_A1_z_1R24)
UART0_RX_M0_DEBUG: R9905.1 U1.AA28(U$2:UART0_RX_M0_JTAG_TMS_M1_GPIO0_D5_u_AA28)
UART0_RX_TP: R9905.2 TP2.1
UART0_TX_M0_DEBUG: R9906.1 U1.1U24(U$4:UART0_TX_M0_JTAG_TCK_M1_GPIO0_D4_u_1U24)
UART0_TX_TP: R9906.2 TP1.1
USB2_OTG0_DM: U1.AL9(U$2:USB2_OTG0_DM_AL9) ; also sheet 1
USB2_OTG0_DP: U1.AK9(U$2:USB2_OTG0_DP_AK9) ; also sheet 1
VCC_1V8_S0: U1.1J20(U$3:VCCIO0_VCC1V8_1J20) ; also sheet 3,4
VCC_1V8_S3: PWR360.VCC_1V8_S3 R1105.1 ; also sheet 2,3,4
VCC_3V3_S3: U1.1U20(U$4:PMUIO1_VCC_1U20) ; also sheet 2,3,4
VCCA1V8_PLDO2_S0: R1147.1 ; also sheet 2
VCCA_1V8_S0: R1119.1 ; also sheet 2,3,4
XIN_24M: C2.1 R37.2 U1.U28(U$2:OSC_XIN_U28) Y1.3
XOUT_24M: R14.2 R37.1 U1.U29(U$2:OSC_XOUT_U29)
Y1_X1: C1.1 R14.1 Y1.1
Unconnected: U1.1A1(U$3:LP4_DQ8_B_LP4X_DQ8_B_LP5_DQ8_B_1A1) U1.1A4(U$3:SPDIF_TX0_M0_FLEXBUS0_D15_M1_UART2_TX_M1_I2C3_SCL_M0_PCIE0_CLKREQN_M2_CAN1_TX_M2_GPIO4_B5_d_1A4) U1.1A5(U$3:SAI1_SDO1_M0_SAI1_SDI3_M0_PDM1_CLK1_M1_FLEXBUS1_D13_M1_SPI4_CLK_M2_UART5_TX_M1_UART6_RTSN_M0_UART2_RTSN_M1_GPIO4_B0_c_1A5) U1.1A6(U$3:SAI1_SDI0_M0_SAI4_SDO_M0_PDM1_SDI0_M1_SPI4_CSN0_M2_SPI3_CSN1_M2_PWM2_CH7_M0_GPIO4_B3_d_1A6) U1.1A7(U$3:VO_LCDC_D21_VO_EBC_GDOE_ETH0_MDC_M0_PDM1_SDI2_M2_DSMC_DATA14_FLEXBUS0_D6_UART1_RX_M2_UART10_CTSN_M0_PWM1_CH2_M3_GPIO3_A6_1A7) U1.1A8(U$3:VO_LCDC_D8_VO_EBC_SDDO8_ETH0_TXD2_M0_SAI2_LRCK_M2_DSMC_INT3_FLEXBUS0_D10_FLEXBUS0_CSN_M2_UART11_CTSN_M0_SPI4_MOSI_M1_I2C9_SDA_M3_PWM2_CH1_M3_GPIO3_C3_d_1A8) U1.1A9(U$3:VO_LCDC_D14_VO_EBC_SDDO14_ETH0_TXD0_M0_SPDIF_TX1_M0_DSMC_DATA8_FLEXBUS0_D0_UART9_CTSN_M1_PWM1_CH5_M3_GPIO3_B5_d_1A9) U1.1A10(U$3:VO_LCDC_D1_VO_EBC_SDDO1_ETH0_RXD3_M0_SAI2_SDI_M2_DSMC_CSN3_FLEXBUS0_D12_FLEXBUS1_D15_M0_FLEXBUS0_CSN_M3_UART2_RTSN_M2_SPI4_CSN1_M1_I3C1_SDA_M2_PWM2_CH4_M3_GPIO3_D2_d_1A10) U1.1A11(U$3:VO_LCDC_D18_VO_EBC_SDCE2_ETH0_RXD1_M0_PDM1_CLK0_M2_DSMC_DATA12_FLEXBUS0_D4_UART10_TX_M0_SPI4_CSN0_M1_PWM1_CH3_M3_GPIO3_B1_d_1A11) U1.1A12(U$3:VO_LCDC_D2_VO_EBC_SDDO2_ETH0_RXCLK_M0_SAI2_MCLK_M2_DSMC_CSN2_FLEXBUS0_D11_FLEXBUS1_CSN_M2_SPI4_CLK_M1_I3C1_SDA_PU_M2_GPIO3_D1_d_1A12) U1.1A13(U$3:VI_CIF_D1_ETH1_TXD3_M0_SAI2_SDO_M1_PDM1_SDI0_M0_UART11_TX_M1_SPI1_CSN0_M1_PWM1_CH3_M2_GPIO2_C4_d_1A13) U1.1A14(U$3:ETH1_TXD0_M0_SAI4_SCLK_M3_UART4_CTSN_M0_I2C5_SCL_M2_PWM1_CH5_M2_GPIO2_C6_d_1A14) U1.1A15(U$3:VI_CIF_D4_ETH1_RXD3_M0_ETH0_PPSCLK_M1_SAI2_MCLK_M1_PDM1_CLK1_M0_UART9_TX_M0_SPI1_CSN1_M1_PWM1_CH1_M2_GPIO2_C1_d_1A15) U1.1A16(U$3:ETH1_RXD0_M0_SAI4_SDO_M3_UART4_RX_M0_I2C6_SDA_M2_PWM2_CH1_M2_GPIO2_D1_d_1A16) U1.1A17(U$3:VI_CIF_D11_SDMMC1_CMD_M1_ETH0_TXD3_M1_SAI0_SDI2_M0_PDM0_SDI1_M3_UART1_CTSN_M1_SPI4_CSN0_M3_PCIE0_CLKREQN_M0_GPIO2_B2_d_1A17) U1.1A18(U$3:VI_CIF_D12_SDMMC1_D3_M1_ETH0_TXD0_M1_SAI0_SDI1_M0_PDM0_SDI2_M3_UART1_RX_M1_GPIO2_B1_d_1A18) U1.1A19(U$3:VI_CIF_CLKI_ETH1_PTP_REFCLK_M0_ETH0_RXD1_M1_SAI3_SDI_M2_SPDIF_TX1_M1_UART3_RTSN_M0_SPI3_CSN0_M0_CAN1_RX_M3_GPIO3_A3_d_1A19) U1.1A20(U$3:VI_CIF_CLKO_ETH1_PPSCLK_M0_ETH0_RXCTL_M1_SAI3_SDO_M2_SPDIF_RX1_M1_UART3_CTSN_M0_SPI3_MISO_M0_CAN1_TX_M3_MIPI_TE_M1_GPIO3_A2_d_1A20) U1.1A21(U$3:SDMMC0_CMD_FSPI1_CSN0_M0_SAI3_SDO_M3_UART5_RX_M2_I2C5_SDA_M0_SPI0_CSN0_M1_PWM2_CH4_M0_GPIO2_A4_d_1A21) U1.1A22(U$3:SARADC_IN1_1A22) U1.1A23(U$3:ETH1_RXCLK_M1_SDMMC1_D2_M0_SAI3_SDO_M1_UART3_CTSN_M2_SPI1_MISO_M0_PCIE0_CLKREQN_M1_GPIO1_B6_d_1A23) U1.1A24(U$3:ETH1_MDC_M1_SAI2_LRCK_M0_I3C0_SCL_M1_PWM1_CH3_M1_GPIO1_D2_d_1A24) U1.1AA1(U$4:LP4_DQ15_A_LP4X_DQ15_A_LP5_DQ15_A_1AA1) U1.1AA3(U$4:LP4_DQ14_A_LP4X_DQ14_A_LP5_DQ14_A_1AA3) U1.1AA5(U$4:LP5_WCK1N_A_1AA5) U1.1AA6(U$4:LP5_WCK1P_A_1AA6) U1.1AA20(U$4:HDMI_TX_REXT_EDP_TX_REXT_1AA20) U1.1AA22(U$4:SAI0_SDO0_M1_DP_HPDIN_M1_UART10_RX_M2_I3C0_SDA_PU_M0_GPIO0_C5_d_1AA22) U1.1AA23(U$4:SAI0_SDI3_M1_SAI0_SDO1_M1_PDM0_SDI3_M0_I2C4_SDA_M0_GPU_AVS_PWM2_CH0_M0_UART1_RTSN_M0_GPIO0_D3_d_1AA23) U1.1AB1(U$4:LP4_DQ9_A_LP4X_DQ9_A_LP5_DQ9_A_1AB1) U1.1AB3(U$4:LP4_DQS1N_A_LP4X_DQS1N_A_LP5_RDQS1N_A_1AB3) U1.1AB4(U$4:LP4_DQS1P_A_LP4X_DQS1P_A_LP5_RDQS1P_A_1AB4) U1.1AC6(U$4:UFS_TX_D0N_1AC6) U1.1AC22(U$4:MIPI_DPHY_CSI1_RX_CLKP_1AC22) U1.1AC23(U$4:MIPI_DPHY_CSI1_RX_CLKN_1AC23) U1.1AD1(U$4:LP4_DQ10_A_LP4X_DQ10_A_LP5_DQ10_A_1AD1) U1.1AD2(U$4:UFS_RSTN_GPIO4_D0_d_1AD2) U1.1AD4(U$4:UFS_TX_D1P_1AD4) U1.1AD5(U$4:UFS_TX_D1N_1AD5) U1.1AD6(U$4:UFS_TX_D0P_1AD6) U1.1AD21(U$4:MIPI_DPHY_CSI2_RX_CLKP_1AD21) U1.1AD22(U$4:MIPI_DPHY_CSI2_RX_CLKN_1AD22) U1.1AE1(U$4:SAI4_SDI_M2_VP1_SYNC_OUT_PCIE0_CLKREQN_M3_SATA0_ACTLED_M1_I2C6_SCL_M3_SPI4_MISO_M0_CAN1_TX_M1_PWM2_CH2_M1_GPIO4_C6_d_1AE1) U1.1AE2(U$4:DSM_AUD_RN_M1_HDMI_TX_SDA_I2C2_SDA_M3_CAN0_RX_M1_UART9_RX_M2_PWM2_CH1_M1_GPIO4_C3_d_1AE2) U1.1AE24(U$4:HDMI_TX_D0P_EDP_TX_D0P_1AE24) U1.1B1(U$3:LP4_DMI1_B_LP4X_DMI1_B_LP5_DMI1_B_1B1) U1.1B3(U$3:LP4_DQ5_B_LP4X_DQ5_B_LP5_DQ5_B_1B3) U1.1B5(U$3:SAI4_LRCK_M0_PDM1_CLK0_M1_FLEXBUS0_D14_M1_SPI3_MISO_M2_UART6_RX_M0_I2C4_SDA_M1_CAN0_RX_M2_GPIO4_A6_d_1B5) U1.1B6(U$3:SAI1_LRCK_M0_FLEXBUS1_D12_M1_SPI4_CSN1_M2_UART5_CTSN_M1_I2C2_SDA_M2_PCIE1_CLKREQN_M2_GPIO4_A5_d_1B6) U1.1B7(U$3:VO_POST_EMPTY_SPDIF_TX0_M1_CAM_CLK2_OUT_M0_SAI4_SDO_M1_DSMC_INT2_FLEXBUS0_D14_M0_FLEXBUS1_D13_M0_FLEXBUS0_CSN_M1_UART3_RX_M1_I2C7_SDA_M2_GPIO4_A1_d_1B7) U1.1B9(U$3:VO_LCDC_D6_VO_EBC_SDDO6_SAI1_SDO0_M1_DSMC_DATA4_FLEXBUS1_D6_UART8_RX_M0_SPI1_MISO_M2_PWM2_CH2_M3_GPIO3_C5_d_1B9) U1.1B10(U$3:VO_LCDC_D10_VO_EBC_SDDO10_ETH0_PTP_REFCLK_M0_SAI1_SDO2_M1_DSMC_DATA6_FLEXBUS1_D8_UART11_RX_M0_SPI2_MISO_M2_I2C5_SDA_M3_CAN0_RX_M3_GPIO3_C1_d_1B10) U1.1B12(U$3:SPDIF_RX0_M1_CAM_CLK1_OUT_M0_SAI4_LRCK_M1_DSMC_INT0_FLEXBUS0_D13_M0_FLEXBUS1_D14_M0_FLEXBUS1_CSN_M3_UART3_TX_M1_SPI1_CSN1_M2_I2C7_SCL_M2_MIPI_TE_M2_GPIO4_A0_d_1B12) U1.1B13(U$3:ISP_PRELIGHT_TRIG_M0_ETH1_MDC_M0_UART6_RTSN_M1_I2C9_SDA_M2_PWM2_CH4_M2_GPIO2_D4_d_1B13) U1.1B15(U$3:SP_FLASH_TRIGOUT_M0_ETH1_MDIO_M0_UART6_CTSN_M1_I2C9_SCL_M2_PWM2_CH5_M2_GPIO2_D5_d_1B15) U1.1B16(U$3:VI_CIF_D10_SDMMC1_CLK_M1_ETH0_TXCLK_M1_SAI0_SDO2_M0_PDM0_CLK1_M3_UART1_RTSN_M1_SPI4_CLK_M3_PCIE1_CLKREQN_M0_GPIO2_B3_d_1B16) U1.1B18(U$3:VI_CIF_VSYNC_ETH1_PPSTRIG_M0_ETH0_MDC_M1_SAI3_LRCK_M2_UART3_RX_M0_SPI3_MOSI_M0_I2C7_SDA_M1_GPIO3_A1_d_1B18) U1.1B19(U$3:SARADC_IN2_1B19) U1.1B21(U$3:SDMMC0_CLK_FSPI1_CLK_M0_SAI3_SCLK_M3_TEST_CLK_OUT_UART5_TX_M2_I2C5_SCL_M0_SPI0_CLK_M1_I3C1_SDA_PU_M1_GPIO2_A5_d_1B21) U1.1B22(U$3:ETH1_TXCLK_M1_SDMMC1_CLK_M0_SAI3_MCLK_M1_PDM0_CLK0_M2_UART3_RX_M2_GPIO1_C1_d_1B22) U1.1B23(U$3:ETH1_TXD0_M1_FSPI1_D0_M1_UART4_TX_M1_UART2_RTSN_M0_SPI2_MOSI_M1_PCIE0_BUTTONRSTN_GPIO1_C4_d_1B23) U1.1B24(U$3:EMMC_D7_SAI0_SDO0_M2_SAI3_SDI_M0_SPI0_CLK_M2_GPIO1_A7_u_1B24) U1.1C1(U$3:LP4_DQ13_B_LP4X_DQ13_B_LP5_DQ13_B_1C1) U1.1C3(U$3:LP4_DQ4_B_LP4X_DQ4_B_LP5_DQ4_B_1C3) U1.1C5(U$3:SAI4_SCLK_M0_PDM1_SDI3_M1_FLEXBUS0_D13_M1_SPI3_MOSI_M2_UART6_TX_M0_I2C4_SCL_M1_CAN0_TX_M2_GPIO4_A4_d_1C5) U1.1C6(U$3:SAI1_SCLK_M0_FLEXBUS1_CSN_M4_SPI3_CSN0_M2_UART5_RTSN_M1_I2C2_SCL_M2_PWM2_CH4_M1_GPIO4_A3_d_1C6) U1.1C7(U$3:VO_LCDC_D4_VO_EBC_SDDO4_SAI1_SCLK_M1_DSMC_DATA2_FLEXBUS1_D4_UART8_RTSN_M0_SPI1_CLK_M2_GPIO3_C7_d_1C7) U1.1C10(U$3:VO_LCDC_VSYNC_VO_EBC_SDCLK_SAI1_SDI3_M1_DSMC_CLKN_FLEXBUS1_CLK_UART5_CTSN_M0_SPI3_MOSI_M1_PWM2_CH6_M3_GPIO3_D6_d_1C10) U1.1C12(U$3:VO_LCDC_D3_VO_EBC_SDDO3_SAI1_MCLK_M1_DSMC_DATA1_FLEXBUS1_D3_UART8_CTSN_M0_SPI1_CSN0_M2_PWM2_CH3_M3_GPIO3_D0_d_1C12) U1.1C15(U$3:VI_CIF_D0_ETH1_TXCLK_M0_SAI2_SDI_M1_PDM1_CLK0_M0_UART11_RX_M1_SPI1_CLK_M1_PWM1_CH4_M2_GPIO2_C5_d_1C15) U1.1C18(U$3:VI_CIF_D8_SDMMC1_DETN_M1_ETH0_RXCLK_M1_SAI0_MCLK_M0_PDM0_CLK0_M3_UART7_RTSN_M0_SPI4_MISO_M3_SATA1_ACTLED_M0_GPIO2_B5_d_1C18) U1.1C19(U$3:SARADC_IN3_1C19) U1.1C22(U$3:ETH1_RXD0_M1_FSPI1_D3_M1_PDM0_SDI1_M2_UART2_RX_M0_I2C8_SDA_M1_SATA_CPDET_GPIO1_C7_d_1C22) U1.1C23(U$3:ETH1_PPSTRIG_M1_SDMMC1_DETN_M0_FSPI1_CSN0_M1_UART4_CTSN_M1_I2C6_SDA_M1_SPI2_CSN0_M1_GPIO1_C3_u_1C23) U1.1C24(U$3:EMMC_D2_FSPI0_D2_SAI0_SDO1_M2_SAI0_SDI3_M2_PDM0_SDI3_M1_UART7_TX_M1_UART6_RTSN_M2_GPIO1_A2_u_1C24) U1.1D2(U$3:LP4_DQ0_B_LP4X_DQ0_B_LP5_DQ0_B_1D2) U1.1D4(U$3:LP5_WCK1P_B_1D4) U1.1D6(U$3:SAI1_MCLK_M0_SAI4_MCLK_M0_AUPLL_CLK_IN_M2_PWM2_CH5_M0_GPIO4_A2_d_1D6) U1.1D7(U$3:VO_LCDC_D5_VO_EBC_SDDO5_SAI1_LRCK_M1_DSMC_DATA3_FLEXBUS1_D5_UART8_TX_M0_SPI1_MOSI_M2_GPIO3_C6_d_1D7) U1.1D9(U$3:VO_LCDC_D7_VO_EBC_SDDO7_SAI1_SDO1_M1_DSMC_DATA5_FLEXBUS1_D7_UART11_TX_M0_SPI2_CSN0_M2_I2C5_SCL_M3_CAN0_TX_M3_GPIO3_C4_d_1D9) U1.1D10(U$3:VO_LCDC_HSYNC_VO_EBC_GDCLK_SAI1_SDI2_M1_DSMC_CLKP_FLEXBUS1_D0_UART5_TX_M0_SPI3_MISO_M1_I2C3_SDA_M2_GPIO3_D5_d_1D10) U1.1D12(U$3:VO_LCDC_D12_VO_EBC_SDDO12_ETH0_PPSTRIG_M0_SAI1_SDI0_M1_DSMC_DQS0_FLEXBUS1_D10_FLEXBUS1_CSN_M0_UART2_RX_M2_UART3_CTSN_M1_I2C4_SDA_M3_GPIO3_B7_d_1D12) U1.1D13(U$3:VO_LCDC_D23_VO_EBC_SDSHR_ETH_CLK0_25M_OUT_M0_SAI4_SDI_M1_DSMC_RDYN_FLEXBUS1_D11_FLEXBUS0_CSN_M0_UART1_CTSN_M2_SPI2_CLK_M2_PWM1_CH0_M3_GPIO3_A4_d_1D13) U1.1D15(U$3:VI_CIF_D3_ETH1_RXCLK_M0_ETH0_PPSTRIG_M1_SAI2_SCLK_M1_PDM1_SDI2_M0_UART11_CTSN_M1_SPI1_MOSI_M1_PWM1_CH2_M2_GPIO2_C2_d_1D15) U1.1D16(U$3:VI_CIF_HREF_ETH0_MDIO_M1_SAI3_SCLK_M2_UART3_TX_M0_SPI3_CLK_M0_I2C7_SCL_M1_GPIO3_A0_d_1D16) U1.1D18(U$3:CAM_CLK1_OUT_M1_ETH_CLK1_25M_OUT_M0_ETH0_MCLK_M1_SAI3_MCLK_M2_SPDIF_RX0_M2_UART9_RTSN_M0_I3C1_SDA_PU_M0_PWM2_CH6_M2_GPIO2_D6_d_1D18) U1.1D19(U$3:SARADC_IN5_1D19) U1.1D21(U$3:SARADC_IN6_1D21) U1.1D22(U$3:ETH1_RXCTL_M1_SAI2_SCLK_M0_UART10_RX_M1_I3C0_SDA_PU_M1_GPIO1_D1_d_1D22) U1.1D23(U$3:EMMC_RSTN_FSPI0_CSN0_UART6_RX_M2_I2C7_SDA_M0_MIPI_TE_M3_PWM2_CH1_M0_GPIO1_B3_u_1D23) U1.1D24(U$3:EMMC_D4_SAI0_MCLK_M2_SAI3_MCLK_M0_SPI0_CSN0_M2_GPIO1_A4_u_1D24) U1.1E1(U$3:LP4_DQ12_B_LP4X_DQ12_B_LP5_DQ1_1E1) U1.1E4(U$3:LP5_WCK1N_B_1E4) U1.1E7(U$3:VO_LCDC_CLK_VO_EBC_SDOE_CAM_CLK0_OUT_M0_SAI4_SCLK_M1_DSMC_RESETN_FLEXBUS0_D15_M0_FLEXBUS1_D12_M0_FLEXBUS1_CSN_M1_UART5_RTSN_M0_SPI3_CSN1_M1_PWM2_CH7_M3_GPIO3_D7_d_1E7) U1.1E9(U$3:VO_LCDC_D11_VO_EBC_SDDO11_ETH0_PPSCLK_M0_SAI1_SDO3_M1_DSMC_DATA7_FLEXBUS1_D9_UART2_TX_M2_UART3_RTSN_M1_I2C4_SCL_M3_GPIO3_C0_d_1E9) U1.1E12(U$3:VO_LCDC_DEN_VO_EBC_SDLE_SAI1_SDI1_M1_DSMC_DATA0_FLEXBUS1_D1_UART5_RX_M0_SPI3_CLK_M1_I2C3_SCL_M2_GPIO3_D4_d_1E12) U1.1E15(U$3:CAM_CLK2_OUT_M1_ETH1_MCLK_M0_ETH_CLK0_25M_OUT_M1_SAI0_SDO3_M0_SPDIF_TX0_M2_UART9_CTSN_M0_SPI3_CSN1_M0_PWM2_CH7_M2_GPIO2_D7_d_1E15) U1.1E18(U$3:SARADC_IN4_1E18) U1.1E19(U$3:SARADC_IN7_1E19) U1.1E21(U$3:ETH1_MCLK_M1_SAI2_MCLK_M0_PDM0_SDI3_M2_SPDIF_RX1_M2_UART10_RTSN_M1_I2C5_SCL_M1_GPIO1_D4_d_1E21) U1.1E22(U$3:ETH_CLK1_25M_OUT_M1_FSPI1_CLK_M1_PDM0_CLK1_M2_SPDIF_TX1_M2_UART10_CTSN_M1_I2C5_SDA_M1_SPI2_CLK_M1_SATA_MPSWIT_CLK1_32K_OUT_GPIO1_D5_d_1E22) U1.1F1(U$3:LP4_DQS0N_B_LP4X_DQS0N_B_LP5_RDQS0N_B_1F1) U1.1F2(U$3:LP4_DQ1_B_LP4X_DQ1_B_LP5_DQ1_B_1F2) U1.1F4(U$3:LP4_A4_B_LP4X_A4_B_LP5_A4_B_1F4) U1.1F22(U$3:EMMC_CMD_FSPI0_RSTN_FSPI0_CSN1_UART6_TX_M2_I2C7_SCL_M0_GPIO1_B0_u_1F22) U1.1F23(U$3:EMMC_STRB_SAI0_SDI0_M2_SAI3_SDO_M0_PDM0_SDI0_M1_SPI0_CSN1_M2_GPIO1_B2_d_1F23) U1.1G1(U$3:LP4_DQ2_B_LP4X_DQ2_B_LP5_DQ2_B_1G1) U1.1G2(U$3:LP4_A3_B_LP4X_A3_B_LP5_A3_B_1G2) U1.1G4(U$3:LP5_WCK0N_B_1G4) U1.1G5(U$3:LP5_WCK0P_B_1G5) U1.1G23(U$3:EMMC_CLK_FSPI0_CLK_SAI0_SDO3_M2_SAI0_SDI1_M2_PDM0_CLK0_M1_PWM2_CH7_M1_GPIO1_B1_d_1G23) U1.1H5(U$3:LP5_A6_B_1H5) U1.1H22(U$3:MIPI_DPHY_CSI3_RX_CLKP_1H22) U1.1H23(U$3:MIPI_DPHY_CSI3_RX_CLKN_1H23) U1.1J1(U$3:LP4_A1_B_LP4X_A1_B_LP5_A1_B_1J1) U1.1J3(U$3:LP4_A2_B_LP4X_A2_B_LP5_A2_B_1J3) U1.1J5(U$3:LP4_CSN0_B_LP4X_CSN0_B_1J5) U1.1J6(U$3:ZQ_B_1J6) U1.1K1(U$3:LP4_CLKP_B_LP4X_CLKP_B_LP5_CLKP_B_1K1) U1.1K2(U$3:LP4_CKE0_B_LP4X_CKE0_B_LP5_CSN_B_1K2) U1.1K4(U$3:LP4_CSN1_B_LP4X_CSN1_B_1K4) U1.1K5(U$3:LP4_A5_B_LP4X_A5_B_LP5_A5_B_1K5) U1.1K22(U$3:MIPI_DPHY_CSI4_RX_CLKP_1K22) U1.1K23(U$3:MIPI_DPHY_CSI4_RX_CLKN_1K23) U1.1L1(U$3:LP4_CLKP_A_LP4X_CLKP_A_LP5_CLKP_A_1L1) U1.1L23(U$3:PCIE1_REFCLKP_1L23) U1.1M3(U$3:LP4_CKE1_B_LP4X_CKE1_B_LP5_CSN1_B_1M3) U1.1M5(U$3:LP4_A4_A_LP4X_A4_A_LP5_A4_A_1M5) U1.1M23(U$3:PCIE1_REFCLKN_1M23) U1.1N1(U$4:LP4_A1_A_LP4X_A1_A_LP5_A1_A_1N1) U1.1N3(U$4:LP4_CKE0_A_LP4X_CKE0_A_LP5_CSN0_A_1N3) U1.1N5(U$4:LP4_CKE1_A_LP4X_CKE1_A_LP5_CSN1_A_1N5) U1.1N22(U$4:PCIE0_REFCLKP_1N22) U1.1N23(U$4:PCIE0_REFCLKN_1N23) U1.1P1(U$4:LP4_DQ2_A_LP4X_DQ2_A_LP5_DQ2_A_1P1) U1.1P5(U$4:LP4_A5_A_LP4X_A5_A_LP5_A5_A_1P5) U1.1P23(U$4:SPI2_MISO_M0_I2C0_SDA_M0_GPIO0_B1_z_1P23) U1.1R3(U$4:LP4_A2_A_LP4X_A2_A_LP5_A2_A_1R3) U1.1R4(U$4:LP4_CSN0_A_LP4X_CSN0_A_1R4) U1.1R5(U$4:LP5_A6_A_1R5) U1.1R6(U$4:ZQ_A_1R6) U1.1T1(U$4:LP4_DQ1_A_LP4X_DQ1_A_LP5_DQ1_A_1T1) U1.1T2(U$4:LP4_A3_A_LP4X_A3_A_LP5_A3_A_1T2) U1.1T4(U$4:LP4_CSN1_A_LP4X_CSN1_A_1T4) U1.1U1(U$4:LP4_DQS0P_A_LP4X_DQS0P_A_LP5_RDQS0P_A_1U1) U1.1U5(U$4:LP4_RESET_LP4X_RESET_LP5_RESET_1U5) U1.1U21(U$4:SDMMC0_DETN_SPI2_CSN1_M0_GPIO0_A7_u_1U21) U1.1U22(U$4:AUPLL_CLK_IN_M1_SPI2_CSN0_M0_I2C0_SCL_M0_GPIO0_B0_z_1U22) U1.1U23(U$4:CLK_32K_IN_CLK0_32K_OUT_I2C6_SCL_M0_GPIO0_A2_d_1U23) U1.1V1(U$4:LP4_DMI0_A_LP4X_DMI0_A_LP5_DMI0_A_1V1) U1.1V3(U$4:LP4_DQ4_A_LP4X_DQ4_A_LP5_DQ4_A_1V3) U1.1V4(U$4:LP5_WCK0N_A_1V4) U1.1V5(U$4:LP5_WCK0P_A_1V5) U1.1V24(U$4:I2C0_SDA_M1_UART8_RX_M2_I3C0_SDA_M0_GPIO0_C2_d_1V24) U1.1W2(U$4:LP4_DQ13_A_LP4X_DQ13_A_LP5_DQ13_A_1W2) U1.1W4(U$4:LP4_DQ5_A_LP4X_DQ5_A_LP5_DQ5_A_1W4) U1.1W21(U$4:PDM0_CLK1_M0_HDMI_TX_CEC_M1_SPI0_CSN1_M0_PWM0_CH1_M0_GPIO0_C3_d_1W21) U1.1W22(U$4:SAI0_MCLK_M1_PDM0_CLK0_M0_UART10_TX_M2_PWM0_CH0_M0_GPIO0_C4_d_1W22) U1.1W23(U$4:SAI0_SDI0_M1_PDM0_SDI0_M0_SPI0_MOSI_M0_GPIO0_D0_d_1W23) U1.1W24(U$4:2C2_SCL_M0_UART1_TX_M0_NPU_AVS_PWM1_CH4_M0_GPIO0_B7_d_1W24) U1.1Y1(U$4:LP4_DQ12_A_LP4X_DQ12_A_LP5_DQ12_A_1Y1) U1.1Y21(U$4:SAI0_SCLK_M1_I2C3_SCL_M1_SPI0_CSN0_M0_GPIO0_C6_d_1Y21) U1.1Y22(U$4:SAI0_SDI2_M1_SAI0_SDO2_M1_PDM0_SDI2_M0_I2C4_SCL_M0_CPUBIG_AVS_PWM1_CH5_M0_UART1_CTSN_M0_GPIO0_D2_d_1Y22) U1.1Y23(U$4:SAI0_LRCK_M1_I2C3_SDA_M1_SPI0_CLK_M0_GPIO0_C7_d_1Y23) U1.1Y24(U$4:SDMMC0_PWREN_SDMMC1_DETN_M2_HDMI_TX_HPDIN_M1_EDP_TX_HPDIN_M1_PWM1_CH2_M0_GPIO0_B6_d_1Y24) U1.A2(U$1:LP4_DQ11_B_LP4X_DQ11_B_LP5_DQ11_B_A2) U1.A3(U$1:LP4_DQS1P_B_LP4X_DQS1P_B_LP5_RDQS1P_B_A3) U1.A5(U$1:LP4_DQ6_B_LP4X_DQ6_B_LP5_DQ6_B_A5) U1.A7(U$1:SAI1_SDO0_M0_SAI4_SDI_M0_SPI3_CLK_M2_PWM2_CH6_M0_GPIO4_A7_d_A7) U1.A9(U$1:VO_LCDC_D22_VO_EBC_GDSP_ETH0_MDIO_M0_PDM1_SDI3_M2_DSMC_DATA15_FLEXBUS0_D7_UART1_RTSN_M2_SPI2_CSN1_M2_PWM1_CH1_M3_GPIO3_A5_d_A9) U1.A11(U$1:VO_LCDC_D16_VO_EBC_SDCE0_ETH0_TXCTL_M0_PDM1_SDI0_M2_DSMC_DATA10_FLEXBUS0_D2_UART9_TX_M1_I2C8_SCL_M3_GPIO3_B3_d_A11) U1.A13(U$1:VO_LCDC_D17_VO_EBC_SDCE1_ETH0_RXD0_M0_PDM1_SDI1_M2_DSMC_DATA11_FLEXBUS0_D3_UART9_RX_M1_I2C8_SDA_M3_GPIO3_B2_d_A13) U1.A15(U$1:VI_CIF_D2_ETH1_TXD2_M0_SAI2_LRCK_M1_PDM1_SDI3_M0_UART11_RTSN_M1_SPI1_MISO_M1_PWM0_CH0_M2_GPIO2_C3_d_A15) U1.A17(U$1:VI_CIF_D5_ETH1_RXD2_M0_ETH0_PTP_REFCLK_M1_PDM1_SDI1_M0_UART9_RX_M0_PWM1_CH0_M2_GPIO2_C0_d_A17) U1.A19(U$1:VI_CIF_D9_SDMMC1_PWREN_M1_ETH0_TXD2_M1_SAI0_SDI3_M0_PDM0_SDI0_M3_UART7_CTSN_M0_SPI4_MOSI_M3_SATA0_ACTLED_M0_GPIO2_B4_d_A19) U1.A21(U$1:VI_CIF_D7_ETH1_PTP_REFCLK_M1_ETH0_RXD3_M1_SAI0_SCLK_M0_UART7_TX_M0_UART8_RTSN_M1_I2C8_SCL_M2_GPIO2_B6_d_A21) U1.A23(U$1:SDMMC0_D2_FSPI1_D2_M0_DSM_AUD_RP_M0_SAI3_LRCK_M3_JTAG_TCK_M0_UART5_RTSN_M2_SPI0_CSN1_M1_CAN1_RX_M0_I3C1_SCL_M1_GPIO2_A2_d_A23) U1.A26(U$1:ETH1_TXCTL_M1_FSPI1_D2_M1_PDM0_SDI0_M2_UART2_TX_M0_I2C8_SCL_M1_SATA_CPPOD_GPIO1_C6_d_A26) U1.A27(U$1:ETH1_TXD2_M1_SDMMC1_D3_M0_SAI3_SDI_M1_UART3_RTSN_M2_SPI1_CSN0_M0_GPIO1_B7_d_A27) U1.A28(U$1:ETH1_RXD2_M1_SDMMC1_D0_M0_SAI3_SCLK_M1_I2C9_SDA_M1_SPI1_CLK_M0_PCIE1_CLKREQN_M1_PWM1_CH0_M1_GPIO1_B_A28) U1.AB1(U$2:LP4_DQ7_A_LP4X_DQ7_A_LP5_DQ7_A_AB1) U1.AB28(U$2:I2C0_SCL_M1_UART8_TX_M2_I3C0_SCL_M0_GPIO0_C1_d_AB28) U1.AB29(U$2:I2C2_SDA_M0_UART1_RX_M0_CPULIT_AVS_PWM1_CH3_M0_GPIO0_C0_d_AB29) U1.AC1(U$2:LP4_DQ6_A_LP4X_DQ6_A_LP5_DQ6_A_AC1) U1.AC28(U$2:SAI0_SDI1_M1_SAI0_SDO3_M1_PDM0_SDI1_M0_SPI0_MISO_M0_GPIO0_D1_d_AC28) U1.AD28(U$2:REF_CLK1_OUT_I2C1_SCL_M1_UART4_TX_M2_PWM1_CH0_M0_GPIO0_B4_d_AD28) U1.AD29(U$2:REF_CLK2_OUT_I2C1_SDA_M1_UART4_RX_M2_PWM1_CH1_M0_GPIO0_B5_d_AD29) U1.AE1(U$2:LP4_DMI1_A_LP4X_DMI1_A_LP5_DMI1_A_AE1) U1.AE28(U$2:MIPI_DPHY_CSI1_RX_D0N_AE28) U1.AE29(U$2:MIPI_DPHY_CSI1_RX_D0P_AE29) U1.AF1(U$2:LP4_DQ8_A_LP4X_DQ8_A_LP5_DQ8_A_AF1) U1.AF28(U$2:MIPI_DPHY_CSI1_RX_D1N_AF28) U1.AF29(U$2:MIPI_DPHY_CSI1_RX_D1P_AF29) U1.AG28(U$2:MIPI_DPHY_CSI1_RX_D2N_MIPI_DPHY_CSI2_RX_D0N_AG28) U1.AG29(U$2:MIPI_DPHY_CSI1_RX_D2P_MIPI_DPHY_CSI2_RX_D0P_AG29) U1.AH1(U$2:LP4_DQ11_A_LP4X_DQ11_A_LP5_DQ11_A_AH1) U1.AH28(U$2:MIPI_DPHY_CSI1_RX_D3N_MIPI_DPHY_CSI2_RX_D1N_AH28) U1.AH29(U$2:MIPI_DPHY_CSI1_RX_D3P_MIPI_DPHY_CSI2_RX_D1P_AH29) U1.AJ1(U$2:SAI4_SCLK_M2_VP2_SYNC_OUT_I2C6_SDA_M3_SPI4_CLK_M0_CAN1_RX_M1_PWM2_CH3_M1_GPIO4_C7_d_AJ1) U1.AJ28(U$2:HDMI_TX_D2P_EDP_TX_D2P_AJ28) U1.AK1(U$2:ISP_FLASH_TRIGOUT_M1_SAI4_SDO_M2_VP0_SYNC_OUT_SATA1_ACTLED_M1_I2C3_SDA_M3_SPI4_MOSI_M0_UART6_RX_M3_PWM2_CH5_M1_GPIO4_C5_d_AK1) U1.AK2(U$2:DSM_AUD_LN_M1_HDMI_TX_HPDIN_M0_PCIE1_CLKREQN_M3_I2C7_SDA_M3_EDP_TX_HPDIN_M0_UART11_RX_M2_PWM0_CH1_M1_GPIO4_C1_d_AK2) U1.AK3(U$2:DSM_AUD_LP_M1_SAI4_MCLK_M2_HDMI_TX_CEC_M0_I2C7_SCL_M3_SPI4_CSN1_M0_UART11_TX_M2_PWM1_CH5_M1_GPIO4_C0_d_AK3) U1.AK4(U$2:UFS_REFCLK_GPIO4_D1_d_AK4) U1.AK5(U$2:OSC_UFS_XIN_AK5) U1.AK7(U$2:UFS_RX_D1P_AK7) U1.AK8(U$2:UFS_RX_D0P_AK8) U1.AK10(U$2:USB3_OTG0_SSRX1P_DP_TX_D0P_AK10) U1.AK11(U$2:USB3_OTG0_SSTX1N_DP_TX_D1N_AK11) U1.AK12(U$2:USB3_OTG0_SSRX2P_DP_TX_D2P_AK12) U1.AK13(U$2:USB3_OTG0_SSTX2N_DP_TX_D3N_AK13) U1.AK15(U$2:MIPI_DPHY_DSI_TX_D0N_MIPI_CPHY_DSI_TX_TRIO0_A_AK15) U1.AK16(U$2:MIPI_DPHY_DSI_TX_D1N_MIPI_CPHY_DSI_TX_TRIO0_C_AK16) U1.AK17(U$2:MIPI_DPHY_DSI_TX_CLKN_MIPI_CPHY_DSI_TX_TRIO1_B_AK17) U1.AK18(U$2:MIPI_DPHY_DSI_TX_D2N_MIPI_CPHY_DSI_TX_TRIO2_A_AK18) U1.AK19(U$2:MIPI_DPHY_DSI_TX_D3N_MIPI_CPHY_DSI_TX_TRIO2_C_AK19) U1.AK20(U$2:MIPI_DPHY_CSI0_RX_D0P_MIPI_CPHY_CSI_RX_TRIO0_B_AK20) U1.AK21(U$2:MIPI_DPHY_CSI0_RX_D1P_MIPI_CPHY_CSI_RX_TRIO1_A_AK21) U1.AK22(U$2:MIPI_DPHY_CSI0_RX_CLKP_MIPI_CPHY_CSI_RX_TRIO1_C_AK22) U1.AK23(U$2:MIPI_DPHY_CSI0_RX_D2P_MIPI_CPHY_CSI_RX_TRIO2_B_AK23) U1.AK24(U$2:MIPI_DPHY_CSI0_RX_D3P_NO_USE_AK24) U1.AK26(U$2:HDMI_TX_D3N_EDP_TX_D3N_AK26) U1.AK27(U$2:HDMI_TX_D0N_EDP_TX_D0N_AK27) U1.AK28(U$2:HDMI_TX_D1P_EDP_TX_D1P_AK28) U1.AK29(U$2:HDMI_TX_D2N_EDP_TX_D2N_AK29) U1.AL2(U$2:DSM_AUD_RP_M1_HDMI_TX_SCL_I2C2_SCL_M3_CAN0_TX_M1_UART9_TX_M2_PWM2_CH0_M1_GPIO4_C2_d_AL2) U1.AL3(U$2:ISP_PRELIGHT_TRIG_M1_SAI4_LRCK_M2_DP_HPDIN_M0_I2C3_SCL_M3_SPI4_CSN0_M0_UART6_TX_M3_PWM2_CH6_M1_GPIO4_C4_d_AL3) U1.AL5(U$2:OSC_UFS_XOUT_AL5) U1.AL6(U$2:UFS_RX_D1N_AL6) U1.AL7(U$2:UFS_RX_D0N_AL7) U1.AL10(U$2:USB3_OTG0_SSRX1N_DP_TX_D0N_AL10) U1.AL11(U$2:USB3_OTG0_SSTX1P_DP_TX_D1P_AL11) U1.AL12(U$2:USB3_OTG0_SSRX2N_DP_TX_D2N_AL12) U1.AL13(U$2:USB3_OTG0_SSTX2P_DP_TX_D3P_AL13) U1.AL15(U$2:MIPI_DPHY_DSI_TX_D0P_MIPI_CPHY_DSI_TX_TRIO0_B_AL15) U1.AL16(U$2:MIPI_DPHY_DSI_TX_D1P_MIPI_CPHY_DSI_TX_TRIO1_A_AL16) U1.AL17(U$2:MIPI_DPHY_DSI_TX_CLKP_MIPI_CPHY_DSI_TX_TRIO1_C_AL17) U1.AL18(U$2:MIPI_DPHY_DSI_TX_D2P_MIPI_CPHY_DSI_TX_TRIO2_B_AL18) U1.AL19(U$2:MIPI_DPHY_DSI_TX_D3P_NO_USE_AL19) U1.AL20(U$2:MIPI_DPHY_CSI0_RX_D0N_MIPI_CPHY_CSI_RX_TRIO0_A_AL20) U1.AL21(U$2:MIPI_DPHY_CSI0_RX_D1N_MIPI_CPHY_CSI_RX_TRIO0_C_AL21) U1.AL22(U$2:MIPI_DPHY_CSI0_RX_CLKN_MIPI_CPHY_CSI_RX_TRIO1_B_AL22) U1.AL23(U$2:MIPI_DPHY_CSI0_RX_D2N_MIPI_CPHY_CSI_RX_TRIO2_A_AL23) U1.AL24(U$2:MIPI_DPHY_CSI0_RX_D3N_MIPI_CPHY_CSI_RX_TRIO2_C_AL24) U1.AL26(U$2:HDMI_TX_D3P_EDP_TX_D3P_AL26) U1.AL28(U$2:HDMI_TX_D1N_EDP_TX_D1N_AL28) U1.B1(U$1:LP4_DQ9_B_LP4X_DQ9_B_LP5_DQ9_B_B1) U1.B2(U$1:LP4_DQ10_B_LP4X_DQ10_B_LP5_DQ10_B_B2) U1.B3(U$1:LP4_DQS1N_B_LP4X_DQS1N_B_LP5_RDQS1N_B_B3) U1.B4(U$1:LP4_DMI0_B_LP4X_DMI0_B_LP5_DMI0_B_B4) U1.B6(U$1:SAI1_SDO3_M0_SAI1_SDI1_M0_PDM1_SDI1_M1_FLEXBUS1_D15_M1_SPI4_MISO_M2_MIPI_TE_M0_GPIO4_B2_d_B6) U1.B7(U$1:SAI1_SDO2_M0_SAI1_SDI2_M0_PDM1_SDI2_M1_FLEXBUS1_D14_M1_SPI4_MOSI_M2_UART5_RX_M1_UART6_CTSN_M0_UART2_CTSN_M1_GPIO4_B1_d_B7) U1.B8(U$1:SPDIF_RX0_M0_FLEXBUS0_CSN_M4_UART2_RX_M1_I2C3_SDA_M0_CAN1_RX_M2_GPIO4_B4_d_B8) U1.B9(U$1:VO_LCDC_D9_VO_EBC_SDDO9_ETH0_TXD3_M0_SAI2_SCLK_M2_DSMC_INT1_FLEXBUS0_D9_UART11_RTSN_M0_SPI4_MISO_M1_I2C9_SCL_M3_PWM2_CH0_M3_GPIO3_C2_d_B9) U1.B10(U$1:VO_LCDC_D15_VO_EBC_SDDO15_ETH0_TXD1_M0_SPDIF_RX1_M0_DSMC_DATA9_FLEXBUS0_D1_UART9_RTSN_M1_PWM1_CH4_M3_GPIO3_B4_d_B10) U1.B11(U$1:VO_LCDC_D13_VO_EBC_SDDO13_ETH0_TXCLK_M0_DSMC_DQS1_FLEXBUS0_CLK_SPI3_CSN0_M1_PWM0_CH1_M3_GPIO3_B6_d_B11) U1.B12(U$1:VO_LCDC_D0_VO_EBC_SDDO0_ETH0_RXD2_M0_SAI2_SDO_M2_DSMC_CSN0_FLEXBUS1_D2_UART2_CTSN_M2_I3C1_SCL_M2_PWM2_CH5_M3_GPIO3_D3_d_B12) U1.B13(U$1:VO_LCDC_D20_VO_EBC_VCOM_ETH0_RXCTL_M0_PDM1_CLK1_M2_DSMC_DATA13_FLEXBUS0_D5_UART1_TX_M2_UART10_RTSN_M0_GPIO3_A7_d_B13) U1.B14(U$1:VO_LCDC_D19_VO_EBC_SDCE3_ETH0_MCLK_M0_SAI4_MCLK_M1_DSMC_CSN1_FLEXBUS0_D8_UART10_RX_M0_SPI2_MOSI_M2_PWM0_CH0_M3_GPIO3_B0_d_B14) U1.B15(U$1:ETH1_TXD1_M0_SAI4_LRCK_M3_UART4_RTSN_M0_I2C5_SDA_M2_PWM0_CH1_M2_GPIO2_C7_d_B15) U1.B16(U$1:ETH1_TXCTL_M0_SAI4_SDI_M3_UART4_TX_M0_I2C6_SCL_M2_PWM2_CH0_M2_GPIO2_D0_d_B16) U1.B17(U$1:CAM_CLK0_OUT_M1_ETH1_RXD1_M0_SAI4_MCLK_M3_UART6_TX_M1_I3C1_SCL_M0_PWM2_CH2_M2_GPIO2_D2_d_B17) U1.B18(U$1:ETH1_RXCTL_M0_UART6_RX_M1_I3C1_SDA_M0_PWM2_CH3_M2_GPIO2_D3_d_B18) U1.B19(U$1:VI_CIF_D13_SDMMC1_D2_M1_ETH0_TXD1_M1_SAI0_SDI0_M0_PDM0_SDI3_M3_UART1_TX_M1_GPIO2_B0_d_B19) U1.B20(U$1:VI_CIF_D14_SDMMC1_D1_M1_ETH0_TXCTL_M1_SAI0_SDO1_M0_UART8_RX_M1_I2C4_SDA_M2_GPIO2_A7_d_B20) U1.B21(U$1:VI_CIF_D6_ETH0_RXD2_M1_SAI0_LRCK_M0_UART7_RX_M0_UART8_CTSN_M1_I2C8_SDA_M2_GPIO2_B7_d_B21) U1.B22(U$1:VI_CIF_D15_SDMMC1_D0_M1_ETH0_RXD0_M1_SAI0_SDO0_M0_UART8_TX_M1_SPI4_CSN1_M3_I2C4_SCL_M2_GPIO2_A6_d_B22) U1.B23(U$1:SDMMC0_D3_FSPI1_D3_M0_DSM_AUD_RN_M0_SAI3_SDI_M3_JTAG_TMS_M0_UART5_CTSN_M2_CAN1_TX_M0_I3C1_SDA_M1_GPIO2_A3_d_B23) U1.B24(U$1:SDMMC0_D0_FSPI1_D0_M0_DSM_AUD_LP_M0_UART0_RX_M1_UART7_RX_M2_I2C8_SCL_M0_SPI0_MOSI_M1_CAN0_RX_M0_PWM2_CH2_M0_GPIO2_A0_d_B24) U1.B25(U$1:SDMMC0_D1_FSPI1_D1_M0_DSM_AUD_LN_M0_SAI3_MCLK_M3_UART0_TX_M1_UART7_TX_M2_I2C8_SDA_M0_SPI0_MISO_M1_CAN0_TX_M0_PWM2_CH3_M0_GPIO2_A1_d_B25) U1.B26(U$1:ETH1_TXD3_M1_SDMMC1_CMD_M0_PDM0_SDI2_M2_UART3_TX_M2_SPI1_CSN1_M0_PWM0_CH0_M1_GPIO1_C0_d_B26) U1.B27(U$1:ETH1_RXD3_M1_SDMMC1_D1_M0_SAI3_LRCK_M1_I2C9_SCL_M1_SPI1_MOSI_M0_PWM1_CH1_M1_GPIO1_B5_d_B27) U1.B28(U$1:ETH1_TXD1_M1_FSPI1_D1_M1_UART4_RX_M1_UART2_CTSN_M0_SPI2_MISO_M1_PCIE1_BUTTONRSTN_GPIO1_C5_d_B28) U1.B29(U$1:ETH1_PPSCLK_M1_SDMMC1_PWREN_M0_FSPI1_RSTN_M1_FSPI1_CSN1_M1_UART4_RTSN_M1_I2C6_SCL_M1_SPI2_CSN1_M1_PWM1_CH2_M1_GPIO1_C2_u_B29) U1.C28(U$1:ETH1_MDIO_M1_SAI2_SDI_M0_I3C0_SDA_M1_PWM1_CH4_M1_GPIO1_D3_d_C28) U1.C29(U$1:ETH1_RXD1_M1_SAI2_SDO_M0_UART10_TX_M1_GPIO1_D0_d_C29) U1.D1(U$1:LP4_DQ15_B_LP4X_DQ15_B_LP5_DQ15_B_D1) U1.D28(U$1:EMMC_D6_SAI3_LRCK_M0_PDM0_CLK1_M1_SPI0_MISO_M2_I2C9_SDA_M0_GPIO1_A6_u_D28) U1.E1(U$1:LP4_DQ14_B_LP4X_DQ14_B_LP5_DQ14_B_E1) U1.E28(U$1:EMMC_D0_FSPI0_D0_SAI0_SCLK_M2_UART7_RTSN_M1_I2C2_SCL_M1_GPIO1_A0_u_E28) U1.E29(U$1:EMMC_D1_FSPI0_D1_SAI0_LRCK_M2_UART7_CTSN_M1_I2C2_SDA_M1_GPIO1_A1_u_E29) U1.F28(U$1:EMMC_D3_FSPI0_D3_SAI0_SDO2_M2_SAI0_SDI2_M2_PDM0_SDI1_M1_UART7_RX_M1_UART6_CTSN_M2_GPIO1_A3_u_F28) U1.G1(U$1:LP4_DQ7_B_LP4X_DQ7_B_LP5_DQ7_B_G1) U1.G28(U$1:EMMC_D5_SAI3_SCLK_M0_PDM0_SDI2_M1_SPI0_MOSI_M2_I2C9_SCL_M0_GPIO1_A5_u_G28) U1.H1(U$1:LP4_DQS0P_B_LP4X_DQS0P_B_LP5_RDQS0P_B_H1) U1.H28(U$1:MIPI_DPHY_CSI3_RX_D0P_H28) U1.H29(U$1:MIPI_DPHY_CSI3_RX_D0N_H29) U1.J28(U$1:MIPI_DPHY_CSI3_RX_D1P_J28) U1.J29(U$1:MIPI_DPHY_CSI3_RX_D1N_J29) U1.K1(U$1:LP4_DQ3_B_LP4X_DQ3_B_LP5_DQ3_B_K1) U1.K28(U$1:MIPI_DPHY_CSI3_RX_D2P_MIPI_DPHY_CSI4_RX_D0_K28) U1.K29(U$1:MIPI_DPHY_CSI3_RX_D2N_MIPI_DPHY_CSI4_RX_D0N_K29) U1.L1(U$1:LP4_A0_B_LP4X_A0_B_LP5_A0_B_L1) U1.L28(U$1:MIPI_DPHY_CSI3_RX_D3P_MIPI_DPHY_CSI4_RX_D1P_L28) U1.L29(U$1:MIPI_DPHY_CSI3_RX_D3N_MIPI_DPHY_CSI4_RX_D1N_L29) U1.M28(U$1:PCIE1_RXP_SATA1_RXP_USB3_OTG1_SSRXP_M28) U1.M29(U$1:PCIE1_RXN_SATA1_RXN_USB3_OTG1_SSRXN_M29) U1.N1(U$1:LP4_CLKN_B_LP4X_CLKN_B_LP5_CLKN_B_N1) U1.N28(U$1:PCIE1_TXP_SATA1_TXP_USB3_OTG1_SSTXP_N28) U1.N29(U$1:PCIE1_TXN_SATA1_TXN_USB3_OTG1_SSTXN_N29) U1.P1(U$2:LP4_CLKN_A_LP4X_CLKN_A_LP5_CLKN_A_P1) U1.P28(U$2:PCIE0_TXN_SATA0_TXN_P28) U1.P29(U$2:PCIE0_TXP_SATA0_TXP_P29) U1.R28(U$2:PCIE0_RXP_SATA0_RXP_R28) U1.R29(U$2:PCIE0_RXN_SATA0_RXN_R29) U1.T1(U$2:LP4_A0_A_LP4X_A0_A_LP5_A0_A_T1) U1.U1(U$2:LP4_DQ3_A_LP4X_DQ3_A_LP5_DQ3_A_U1) U1.V29(U$2:REF_CLK0_OUT_AUPLL_CLK_IN_M0_GPIO0_A0_d_V29) U1.W1(U$2:LP4_DQ0_A_LP4X_DQ0_A_LP5_DQ0_A_W1) U1.Y1(U$2:LP4_DQS0N_A_LP4X_DQS0N_A_LP5_RDQS0N_A_Y1) U1.Y29(U$2:PWR_CTRL3_I2C6_SDA_M0_GPIO0_A5_d_Y29)

### Notes on the sheet
- PROJECT FRIDAY — S5: RK3576 CLOCK (24MHz + PVTM), RESET, BOOT/MASKROM, PMIC I2C & DEBUG UART — EVB P.11,26,27 | REV SCH-1 | PRINCIPLE: COPY RK3576 EVB1 V1.2
- CITATIONS: EVB Sheet 11 (OSC, Reset, SARADC_IN0_BOOT Config 10, PMUIO), Sheet 26 (MaskROM Key), Sheet 27 (Debug UART0); HDG Table 2-1 (Internal PMU_PVTM, no 32k XTAL).
- 32.768 kHz RTC: Internal PMU_PVTM module (HDG s2 Table 2-1); Y2 & C3/C4 omitted.

## Library data of the parts
C1 C2 C35-C42 C81 C82 C100-C105 C110 C1303 C1306 C2311 C2317 C2329 C2334 C2351 C2352 C2357 C2360-C2363 C2365-C2370 C2372 C2402 C2403 C2405 C2407 = FRIDAY_SCH1_Support:C_0402
C7-C10 C13 C1040 = FRIDAY_SCH1_Support:C_0805
C11 C12 C14-C18 C47 C48 C53-C68 C71-C80 C85 C86 C106 C107 C111 C1007 C1013 C1021 C1030 C1031 C1037-C1039 C1204 C1205 C1210 C1211 C2410-C2413 C2423 = FRIDAY_SCH1_Support:C_0603
C83 C84 = FRIDAY_SCH1_Support:C_0603; LCSC: C15850
C1000-C1005 C1009-C1011 C1015-C1018 C1023 C1024 C1026-C1028 C1032-C1035 C1102-C1108 C1116-C1119 C1200-C1202 C1206-C1208 C1212-C1214 C1300 C1302 C1305 C1308 C1309 C1400-C1403 C1405 C1406 C1408 C1503-C1506 C1509 C1801 C1802 C1901 C1903 = FRIDAY_SCH1_Support:C_0201
C1006 C1012 C1020 C1029 C1036 C1203 C1209 = FRIDAY_SCH1_Support:C_0402_BGA
D1 = USBLC6-2SC6:USBLC6-2SC6; DATASHEET_URL: https://s3.amazonaws.com/snapeda/datasheet/USBLC6-2SC6_STMicroelectronics.pdf; DESCRIPTION: 17V Clamp 5A (8/20µs) Ipp Tvs Diode Surface Mount SOT-23-6; MANUFACTURER: STMicroelectronics; MPN: USBLC6-2SC6; PACKAGE: SOT-23-6 STMicroelectronics; SOURCE_URL: https://www.snapeda.com/parts/USBLC6-2SC6/STMicroelectronics/view-part/
D2 = FRIDAY_SCH1_Support:TVS_VBUS; SPEC: Unidir 5.0V/6.0V VBUS TVS
D3 = FRIDAY_SCH1_Support:PSUR1610DNV07; EVB: D2300; MPN: PSUR1610DNV07
D2301 = FRIDAY_SCH1_Support:B5819WS
J1 = TYPE-C-31-M-12:TYPE-C-31-M-12; DATASHEET_URL: https://snapeda.s3.amazonaws.com/datasheet/2205251630_Korean-Hroparts-Elec-TYPE-C-31-M-12_C165948.pdf; DESCRIPTION: USB Connectors 24 Receptacle 1 8.94*7.3mm RoHS; LCSC: C165948; MANUFACTURER: HRO Electronics Co., Ltd.; MAXIMUM_PACKAGE_HEIGHT: 3.26 mm; MPN: TYPE-C-31-M-12; PARTREV: 2020.12.08; Package: Package; SOURCE_URL: https://www.snapeda.com/parts/TYPE-C-31-M-12/HRO+Electronics+Co.%252C+Ltd./view-part/; STANDARD: Manufacturer Recommendations
J4 = FRIDAY_SCH1_Support:BATT_PADS_2PIN; LCSC: N/A; MPN: SMD_PADS_2.5x3.0mm
L1-L10 = FRIDAY_SCH1_Support:IND_2016
L11 L12 = FRIDAY_SCH1_Support:IND_2520
L13 = FRIDAY_SCH1_Support:IND_4040; SPEC: Isat>=6.5A DCR<25mR
PWR1 PWR3 PWR5 = FRIDAY_SCH1_Support:VBAT_2S_IN
PWR9 PWR11 PWR13 PWR15 PWR30 PWR36 = FRIDAY_SCH1_Support:VBAT_BUCK_5V
PWR19 PWR21 PWR23 PWR25 PWR28 PWR32 PWR34 = FRIDAY_SCH1_Support:VBUS_5V
PWR40 PWR41 PWR43 PWR45 PWR57 PWR65 PWR77 PWR85 PWR93 PWR101 PWR111 PWR117 PWR125 PWR137 PWR165 PWR167 PWR173 PWR176 PWR185 = FRIDAY_SCH1_Support:VCC5V0_SYS_S5
PWR47 PWR49 PWR51 PWR53 PWR55 PWR205 PWR207 PWR209 PWR211 PWR213 PWR215 PWR217 PWR219 = FRIDAY_SCH1_Support:VDD_CPU_BIG_S0
PWR59 PWR61 PWR63 PWR261 PWR263 PWR265 PWR267 PWR269 PWR271 PWR273 PWR275 = FRIDAY_SCH1_Support:VDD_NPU_S0
PWR67 PWR69 PWR71 PWR73 PWR75 PWR221 PWR223 PWR225 PWR227 PWR229 = FRIDAY_SCH1_Support:VDD_CPU_LIT_S0
PWR79 PWR81 PWR83 PWR199 PWR332 = FRIDAY_SCH1_Support:VCC_3V3_S3
PWR87 PWR89 PWR91 PWR247 PWR249 PWR251 PWR253 PWR255 PWR257 PWR259 = FRIDAY_SCH1_Support:VDD_GPU_S0
PWR95 PWR97 PWR99 PWR277 PWR279 PWR281 PWR283 PWR285 PWR287 = FRIDAY_SCH1_Support:VDDQ_DDR_S0
PWR103 PWR105 PWR107 PWR109 PWR231 PWR233 PWR235 PWR237 PWR239 PWR241 PWR243 PWR245 = FRIDAY_SCH1_Support:VDD_LOGIC_S0
PWR113 PWR115 PWR194 PWR330 PWR360 = FRIDAY_SCH1_Support:VCC_1V8_S3
PWR127 PWR129 PWR131 PWR133 PWR289 PWR291 PWR293 PWR295 PWR297 PWR299 = FRIDAY_SCH1_Support:VDD_DDR_S0
PWR135 PWR179 PWR181 PWR183 = FRIDAY_SCH1_Support:VCC_2V0_PLDO_S3
PWR139 PWR141 PWR188 PWR190 PWR192 = FRIDAY_SCH1_Support:VCC_1V1_NLDO_S3
PWR143 PWR317 PWR319 PWR321 = FRIDAY_SCH1_Support:VCCA_1V8_S0
PWR145 = FRIDAY_SCH1_Support:VCCA1V8_PLDO2_S0
PWR147 PWR328 = FRIDAY_SCH1_Support:VDDA_1V2_S0
PWR149 = FRIDAY_SCH1_Support:VCCA_3V3_S0
PWR151 PWR340 = FRIDAY_SCH1_Support:VCCIO_SD_S0
PWR153 PWR307 PWR309 = FRIDAY_SCH1_Support:VDD_0V75_S3
PWR155 PWR303 = FRIDAY_SCH1_Support:VDDA_DDR_PLL_S0
PWR157 = FRIDAY_SCH1_Support:VDDA0V75_HDMI_S0
PWR159 = FRIDAY_SCH1_Support:VDDA_0V85_S0
PWR161 PWR311 PWR313 PWR315 = FRIDAY_SCH1_Support:VDDA_0V75_S0
PWR163 PWR169 PWR170 = FRIDAY_SCH1_Support:VCCA1V8_PLDO6_S3
PWR197 PWR336 PWR338 = FRIDAY_SCH1_Support:VCC_1V8_S0
PWR202 PWR342 PWR344 PWR346 = FRIDAY_SCH1_Support:VCC_3V3_S0
PWR305 = FRIDAY_SCH1_Support:DDR_PLL_AVDD1V8
PWR323 PWR325 = FRIDAY_SCH1_Support:MIPI_DCPHY_AVDD
PWR352 = FRIDAY_SCH1_Support:OSC_1V8
PWR354 PWR356 = FRIDAY_SCH1_Support:SARADC_AVDD1V8
R1 R2 R5 R6 R14 R16-R19 R21 R22 R24-R29 R31 R32 R37 R100-R111 R1105 R1202 R2302 R2304 R2305 R2314 R2320 R2321 R2324 R2330 R2332 R2405 R2406 R2411-R2414 R9006 = FRIDAY_SCH1_Support:R_0402
R1106 R1107 R1112 R1114 R1116 R1122 R1123 R1401 R1402 R9905 R9906 = FRIDAY_SCH1_Support:R_0201
R1119 R1147 R1320 R1323 R1502 R2427 = FRIDAY_SCH1_Support:R_0603
SW1 SW2 = TS-1187A-B-A-B:TS-1187A-B-A-B; DATASHEET_URL: https://snapeda.s3.amazonaws.com/datasheets753-1901111503_XKB-Enterprise-TS-1187A-B-A-B_C318884.pdf; DESCRIPTION: Tact swicth.; LCSC: C318884; MANUFACTURER: XKB Industrial Precision; MAXIMUM_PACKAGE_HEIGHT: 1.5mm; MPN: TS-1187A-B-A-B; PARTREV: A0; Package: Package; SOURCE_URL: https://www.snapeda.com/parts/TS-1187A-B-A-B/XKB+Connection/view-part/; STANDARD: Manufacturer Recommendations
TP1-TP3 TP2318 = FRIDAY_SCH1_Support:TP_1MM
U1 = RK3576:RK3576; FOOTPRINT_STATUS: UNVERIFIED vs RK3576 DS s2; LCSC: C42388007; MPN: RK3576
U2 = RK806-1:RK806-1; DESCRIPTION: RK806-1 Power Management IC; LCSC: C49174044 (UNVERIFIED); MANUFACTURER: rockchip; MAXIMUM_PACKAGE_HEIGHT: 0.90mm; MPN: RK806S-5; PARTREV: 1.3; SOURCE_URL: https://www.snapeda.com/parts/RK806-1/Rockchip/view-part/; STANDARD: IPC-7351B
U5 = TPS2121RUXR:TPS2121RUXR; DATASHEET_URL: https://s3.amazonaws.com/snapeda/datasheet/TPS2121RUXR_Texas_Instruments.pdf; DESCRIPTION: 2.7-V&nbsp;to 22-V, 56-mΩ, 4.5-A, power mux with seamless switchover; MANUFACTURER: Texas Instruments; MPN: TPS2121RUXR; Package: VQFN-HR-12 Texas Instruments; SOURCE_URL: https://www.snapeda.com/parts/TPS2121RUXR/Texas+Instruments/view-part/; STANDARD: Manufacturer Recommendations
U6 U7 = FRIDAY_SCH1_Support:TMI3112H; LCSC: C2985060; MPN: TMI3112H
U8 = SY6280AAC:SY6280AAC; DATASHEET_URL: https://snapeda.s3.amazonaws.com/datasheets/SY6280AAC.PDF; DESCRIPTION: Power/protection Switch; LCSC: C55136; MANUFACTURER: Silergy; MAXIMUM_PACKAGE_HEIGHT: 1.3 mm; MPN: SY6280AAC; PARTREV: 1.0C; Package: SOT-23-5 Silergy; SNAPEDA_PACKAGE_ID: 29139; SOURCE_URL: https://www.snapeda.com/parts/SY6280AAC/Silergy/view-part/; STANDARD: IPC 7351B
U9 = FRIDAY_SCH1_Support:CW3301; MPN: CW3301
U10 = SY8205FCC:SY8205FCC; DATASHEET_URL: https://snapeda.s3.amazonaws.com/datasheets/2056-1809050154_Silergy-Corp-SY8205FCC_C111875.pdf; DESCRIPTION: High-Efficiency Fast Response，5A, 30V Input Synchronous Step Down Regulator; LCSC: C111875; MANUFACTURER: Silergy; MAXIMUM_PACKAGE_HEIGHT: 1.60 mm; MPN: SY8205FCC; PARTREV: 0.4; Package: Package; SOURCE_URL: https://www.snapeda.com/parts/SY8205FCC/Silergy/view-part/; STANDARD: Manufacturer Recommendations
Y1 = X322524MOB4SI_24MHz:X322524MSB4SI; Copyright: Copyright (C) 2026 Ultra Librarian. All rights reserved.; LCSC: C70590; MPN: X322524MOB4SI; Manufacturer_Name: YXC; Manufacturer_Part_Number: X322524MSB4SI